# Altium project Zybo_Z7.PrjPcb (part 2 of 3)

## Sheet USB_OTG.SchDoc
size A4; SheetNumber: 7; SheetTotal: 13
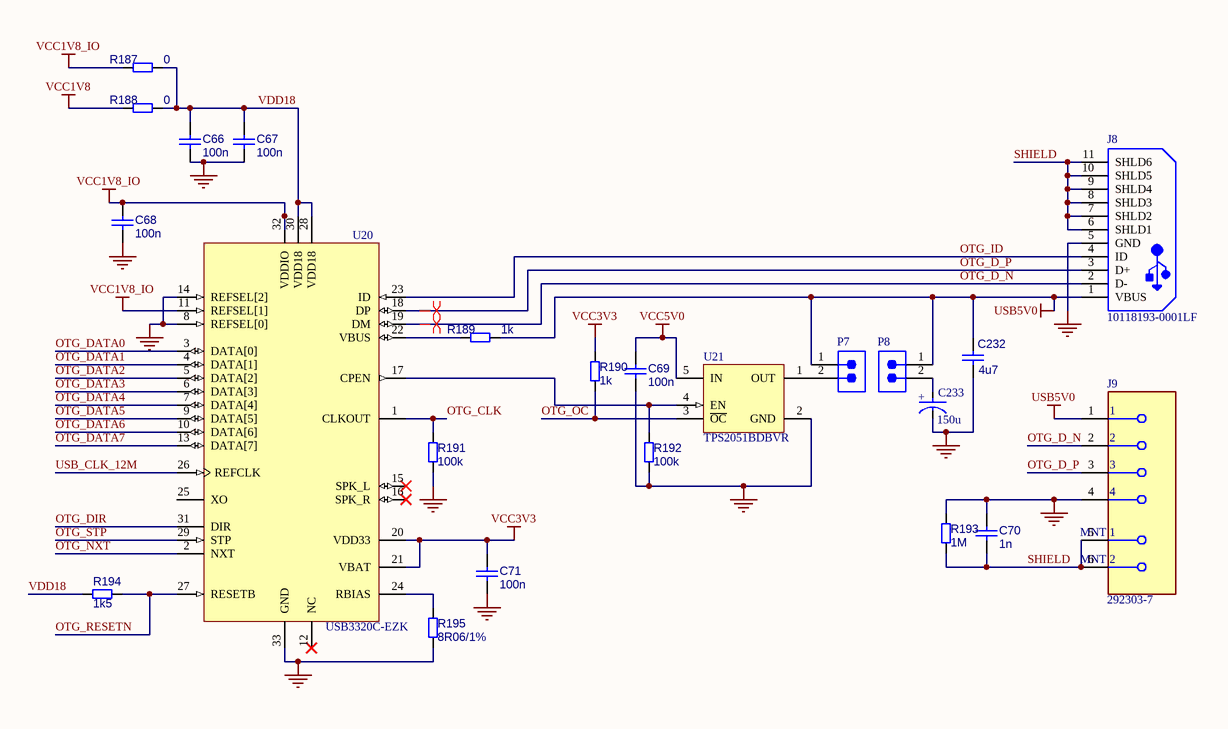
[diagram p6: USB_OTG.SchDoc]

### Parts
C66  100n  [CAPC1005X50N_0402]
C67  100n  [CAPC1005X50N_0402]
C68  100n  [CAPC1005X50N_0402]
C69  100n  [CAPC1005X50N_0402]
C70  1n  [CAPC1005X50N_0402]
C71  100n  [CAPC1005X50N_0402]
C232  4u7  [C_0805]
C233  150u  [FP-TAJD-MFG]
J8  10118193-0001LF  [FCI-10118193-0001LF-5_V]
J9  292303-7  [FP-292303-7-MFG]
P7  Male Pin Header 2x1 2.54mm  [Copy of Copy of Copy of Copy of 3M-2340-6111TG_V]  (value not drawn)
P8  Male Pin Header 2x1 2.54mm  [Copy of Copy of Copy of Copy of 3M-2340-6111TG_V]  (value not drawn)
R187  0  [R_0402]
R188  0  [R_0402]
R189  1k  [R_0402]
R190  1k  [R_0402]
R191  100k  [R_0402]
R192  100k  [R_0402]
R193  1M  [R_0402]
R194  1k5  [R_0402]
R195  8R06/1%  [R_0402]
U20  USB3320C-EZK  [MCHP-QFN-32-5x5_V2]
U21  TPS2051BDBVR  [DBV0005A_L]

### Nets
GND: C66.1 C67.1 C68.1 C69.1 C70.2 C71.1 C232.1 C233.1(C) J8.5(GND) J9.4 R191.2 R192.2 R193.1 R195.2 U20.8(REFSEL[0]) U20.14(REFSEL[2]) U20.33(GND) U21.2(GND)
USB5V0: C232.2 J8.1(VBUS) J9.1 P7.1 P8.1 R189.2
VCC1V8: R188.2
VCC1V8_IO: C68.2 R187.2 U20.11(REFSEL[1]) U20.32(VDDIO)
VCC3V3: C71.2 R190.1 U20.20(VDD33) U20.21(VBAT)
VCC5V0: C69.2 U21.5(IN)
OTG_CLK: R191.1 U20.1(CLKOUT)
OTG_D_N: J8.2(D-) J9.2 U20.19(DM)
OTG_D_P: J8.3(D+) J9.3 U20.18(DP)
OTG_DATA0: U20.3(DATA[0])
OTG_DATA1: U20.4(DATA[1])
OTG_DATA2: U20.5(DATA[2])
OTG_DATA3: U20.6(DATA[3])
OTG_DATA4: U20.7(DATA[4])
OTG_DATA5: U20.9(DATA[5])
OTG_DATA6: U20.10(DATA[6])
OTG_DATA7: U20.13(DATA[7])
OTG_DIR: U20.31(DIR)
OTG_ID: J8.4(ID) U20.23(ID)
OTG_NXT: U20.2(NXT)
OTG_OC: R190.2 U21.3(~{OC})
OTG_RESETN: R194.1 U20.27(RESETB)
OTG_STP: U20.29(STP)
SHIELD: C70.1 J8.6(SHLD1) J8.7(SHLD2) J8.8(SHLD3) J8.9(SHLD4) J8.10(SHLD5) J8.11(SHLD6) J9.5(MNT_1) J9.6(MNT_2) R193.2
USB_CLK_12M: U20.26(REFCLK)
VDD18: C66.2 C67.2 R187.1 R188.1 R194.2 U20.28(VDD18) U20.30(VDD18)
NetC233_2: C233.2(A) P8.2
NetP7_2: P7.2 U21.1(OUT)
NetR189_1: R189.1 U20.22(VBUS)
NetR192_1: R192.1 U20.17(CPEN) U21.4(EN)
NetR195_1: R195.1 U20.24(RBIAS)

Not connected (* = marked no-connect by the designer): U20 12(NC)* 15(SPK_L)* 16(SPK_R)* 25(XO)

### Layout directives
differential pair: OTG_D_N, OTG_D_P

### Notes on the sheet
- (in symbol CMP-04424-000170-1) +

### Library data of the parts
C66-C71 = CMP-001-00084-2: MLCC 0402
C232 = CMP-001-00086-2: MLCC 0805
C233 = CMP-04424-000170-1: 47uF 6.3V  ±20% 1.1Ω 2917  SMD Tantalum Capacitor; ESR (Equivalent Series Resistance): 1.1R; Dissipation Factor: 6%; Polarity: Polar; Voltage Rating: 6.3V; Width: 0.169inch; Tolerance: 20%; Series: TAJ; Case/Package: 2917; Max Operating Temperature: 125°C; Depth: 4.3mm; Voltage Rating (DC): 6.3V; Package Quantity: 500; Lead Free: Lead Free; Mount: Surface Mount; Length: 0.287inch; Min Operating Temperature: -55°C; Features: General Purpose; Packaging: Tape and Reel; Capacitance: 47uF; Height - Seated (Max): 0.122inch; RoHS Compliant: Yes
J8 = CMP-2000-05119-1: Micro USB B Type Receptacle, -55 to 85 degC, 5-Pin SMD, RoHS, Tape and Reel; Manufacturer: FCI; Insulation Resistance: 1000MOhms; Gender: Female; Current Rating: 1.8A; Number of Contacts: 5Contact; Connector Type: MicroUSBTypeBreceptacle; Mounting Angle: Right; Datasheet Version: Rev. C, 05/2015; Packaging: Reel; Product Category: USBConnectors; Standard: USB2.0; Factory Pack Quantity: 1200; Operating Temperature Range: -55Cto+85C; Termination Style: SMD/SMT; Datasheet URL: http://datasheet.octopart.com/10118193-0001LF-FCI-datasheet-55953155.pdf; Contact Material: CopperAlloy; RoHS: Details; Contact Plating: Gold; Flammability Rating: UL94V-0; Manufacturer URL: http://www.fci.com/; Brand: FCI; Product: MicroUSBTypeBConnectors; Color: Black
J9 = CMP-03360-000008-1: CONN RCPT USB2.0 TYPEA 4P SMD RA; Manufacturer: TE Connectivity; Is Female: yes; Current Rating: 1A; Number Of Contacts: 4; Voltage Rating: 30V; Conn Orientation: Right Angle; Shielding: true; Digikey Description: CONN RCPT USB2.0 TYPEA 4P SMD RA; Manufacturer Part Number: 292303-7; Automotive: No; Category: Conn; Temperature: -55°C to +85°C; ComponentLink2Description: Datasheet; Mouser Description: USB Connectors USB A R/A Recpt Assy SMT; Contact Material: Gold,Nickel; Package: 292303-7; Device Class L3: unset; Octopart: https://octopart.com/292303-7-te+connectivity-42840369; RoHS: TRUE; Device Class L2: USB Connectors; ComponentLink2URL: https://www.te.com/usa-en/product-292303-7.html?te_bu=Cor&te_type=other&te_campaign=oct_glo_cor-oct-global-oth-prtnr-fy19-oct-octo-buy-bom_sma-298_2&elqCampaignId=35216; Temperature Range Low: -55°C; Usb Standard: USB 2.0; Temperature Range High: +85°C; Lead Free: Yes; Device Class L1: Connectors
P7 P8 = CMP-002-00078-1: Male Header, Pitch 2.54 mm, 2x 1 Position, Height 8.636 mm, Tail Length 3.05 mm, -55 to 105 degC, RoHS, Bulk; Manufacturer: 3M; Max Current Rating: 3A; Rows: 1; Gender: Male; Max Operating Temperature: 105°C; Contact Finish: Gold; Datasheet URL: https://datasheet.ciiva.com/5161/ts0766-242217-5161112.pdf; Pins: 40; Package Description: Male Header, Pitch 2.54 mm, 1 x 40 Position, Height 8.636 mm, Tail Length 3.05 mm; Contact Material: Copper; Package Reference: 2340-6111TG; Package Quantity: 200; Current Rating: 3A; Datasheet Version: Aug-08; Min Operating Temperature: -55°C; Connector Type: Header; Contact Plating: Gold; Case/Package: 2340-6111TG; Packaging: Bulk; RoHS Compliant: True; Manufacturer URL: http://www.3m.com/; Lead Pitch: 0.1inch; Colour: Black; Mounting Technology: TH
R187-R195 = CMP-009-00178-3: Chip 0402 resistor
U20 = CMP-020-00028-1: Microchip USB3320C-EZK; USB Transceiver; USB 2.0 at 480Mbit/s; 32-Pin QFN; Max Supply Voltage: 2V; Frequency: 60MHz; Min Supply Voltage: 1.6V; Max Operating Temperature: 85°C; Mounting Technology: Surface Mount; Min Operating Temperature: -40°C; Pins: 32
U21 = CMP-2000-07277-1: Current-Limited, Power-Distribution Switch, 2.7 to 5.5 V, -40 to 85 degC, 5-Pin SOT-23 (DBV), Green (RoHS & no Sb/Br), Tape and Reel; Manufacturer: TexasInstruments; Number of Outputs: 1Output; Operating Supply Voltage: 2.7Vto5.5V; Supply Voltage - Min: 2.7V; Supply Voltage - Max: 5.5V; Current Limit: 1A; Development Kit: TPS2051BEVM; Output Current: 500mA; On Resistance - Max: 70mOhms; Package Version: 4073253-4/N, 12/2014; Mounting Technology: SurfaceMount; Packaging: Reel; Package / Case: SOT-23-5; Maximum Operating Temperature: +85C; Package Description: 5-Pin Small Outline Transistor, Body 2.9 x 1.6 mm, Pitch 0.95 mm; Type: HighSide; Product: USBCurrentLimitedPowerSwitches; Minimum Operating Temperature: -40C; Manufacturer URL: http://www.ti.com/; Factory Pack Quantity: 3000; Mounting Style: SMD/SMT; Brand: TexasInstruments; Package Reference: DBV5; Package URL: http://www.ti.com/lit/ml/mpds018l/mpds018l.pdf; Datasheet URL: http://www.ti.com/general/docs/lit/getliterature.tsp?genericPartNumber=TPS2051B&fileType=pdf; Product Category: PowerSwitchICs-PowerDistribution; Series: TPS2051B; Datasheet Version: Rev. L, 06/2011; RoHS: Details

## Sheet FPGA_Config_Flash.SchDoc
size A4; SheetNumber: 8; SheetTotal: 13
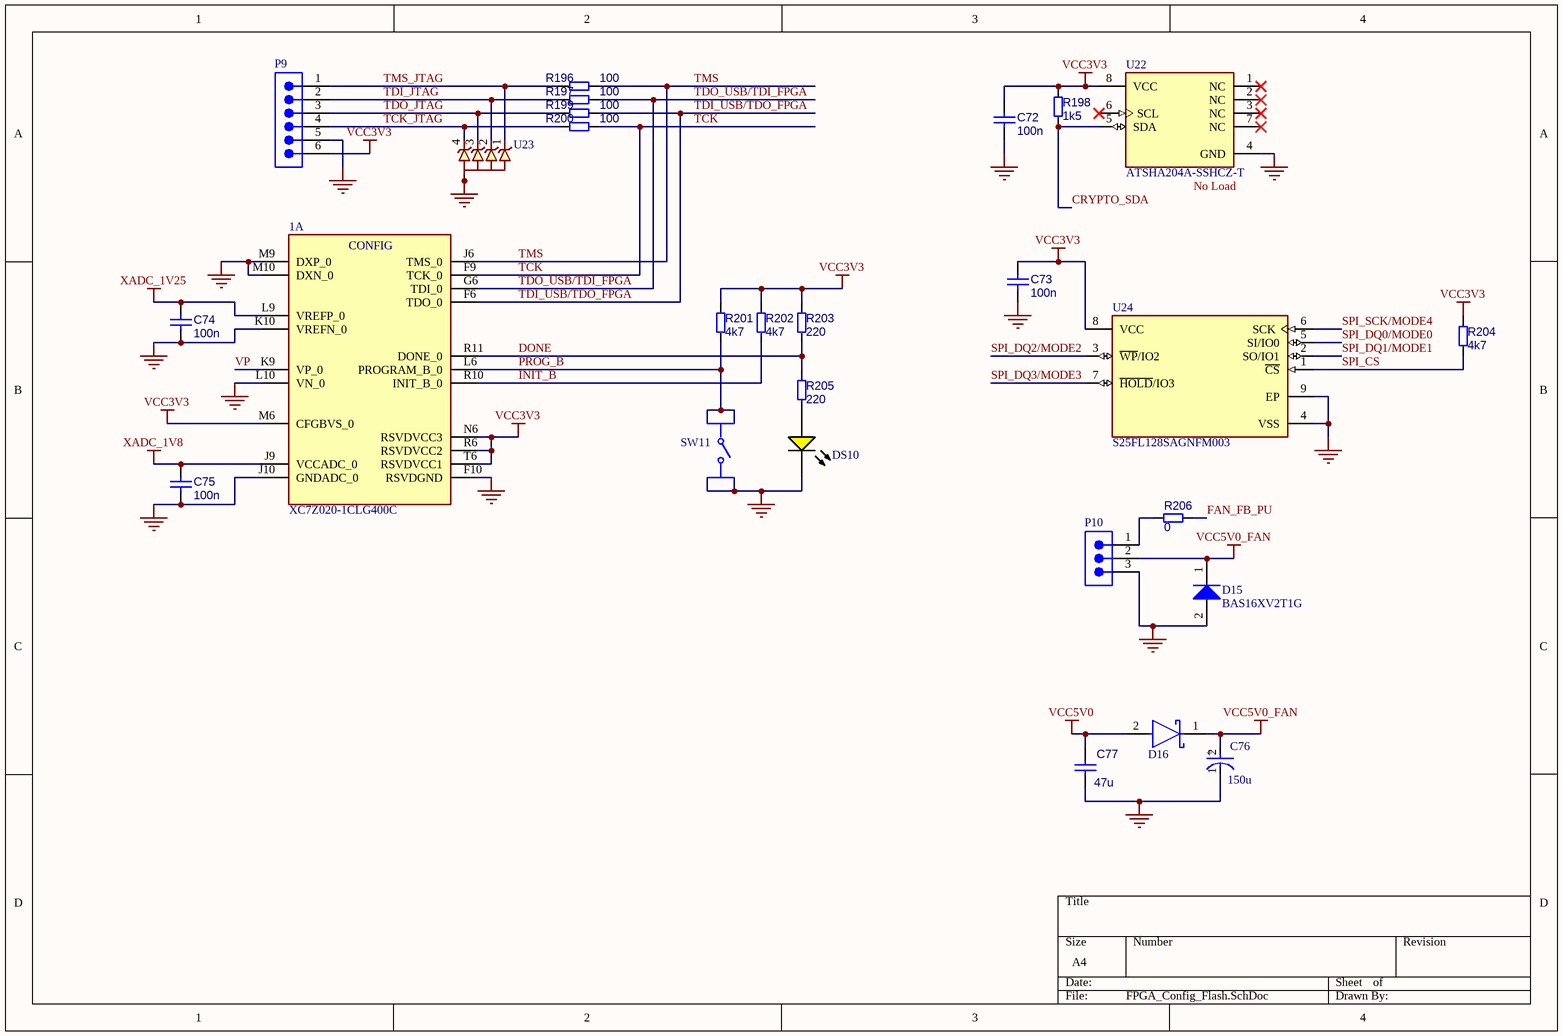
[diagram p7: FPGA_Config_Flash.SchDoc]

### Parts
1  XC7Z020-1CLG400C  [BGA400C80P20X20_1700X1700X160]  (part A of 9)
C72  100n  [CAPC1005X50N_0402]
C73  100n  [CAPC1005X50N_0402]
C74  100n  [CAPC1005X50N_0402]
C75  100n  [CAPC1005X50N_0402]
C76  150u  [FP-TAJD-MFG]
C77  47u  [C_1210]
D15  BAS16XV2T1G  [ONSC-SOD-523-2-502-01_V]
D16  CDBU0130L  [FP-502-01-MFG]  (value not drawn)
DS10  19-217/Y5C-AM1N1VY/3T  [EVRL-0603-2_V]  (value not drawn)
P9  Male Pin Header 1x6 2.54mm  [Copy of Copy of Copy of Copy of 3M-2340-6111TG_V]  (value not drawn)
P10  Male Pin Header 1x3 2.54mm  [Copy of Copy of Copy of Copy of Copy of 3M-2340-6111TG_V]  (value not drawn)
R196  100  [R_0402]
R197  100  [R_0402]
R198  1k5  [R_0402]
R199  100  [R_0402]
R200  100  [R_0402]
R201  4k7  [R_0402]
R202  4k7  [R_0402]
R203  220  [R_0402]
R204  4k7  [R_0402]
R205  220  [R_0402]
R206  0  [R_0402]
SW11  1301.9316.24  [FP-1301_9316_24-MFG]  (value not drawn)
U22  ATSHA204A-SSHCZ-T  [FP-C04-057-IPC_A]
U23  TVS0701DRBR  [FP-DRB0008A-MFG]  (value not drawn)
U24  S25FL128SAGNFM003  [FP-PG-WSON-8-IPC_A]

### Nets
GND: 1.F10(RSVDGND) 1.J10(GNDADC_0) 1.K10(VREFN_0) 1.L10(VN_0) 1.M9(DXP_0) 1.M10(DXN_0) C72.1 C73.1 C74.1 C75.1 C76.1(C) C77.1 D15.2(A) DS10.2(K) P9.5 P10.3 SW11.1 SW11.2 U22.4(GND) U23.5(GND) U23.6(GND) U23.7(GND) U23.8(GND) U23.9(Thermal_Pad) U24.4(VSS) U24.9(EP)
VCC3V3: 1.M6(CFGBVS_0) 1.N6(RSVDVCC3) 1.R6(RSVDVCC2) 1.T6(RSVDVCC1) C72.2 C73.2 P9.6 R198.2 R201.2 R202.2 R203.2 R204.2 U22.8(VCC) U24.8(VCC)
VCC5V0: C77.2 D16.2(A)
VCC5V0_FAN: C76.2(A) D15.1(K) D16.1(C) P10.2
XADC_1V8: 1.J9(VCCADC_0) C75.2
XADC_1V25: 1.L9(VREFP_0) C74.2
CRYPTO_SDA: R198.1 U22.5(SDA)
DONE: 1.R11(DONE_0) R203.1 R205.2
FAN_FB_PU: R206.1
INIT_B: 1.R10(INIT_B_0) R202.1
PROG_B: 1.L6(PROGRAM_B_0) R201.1 SW11.3 SW11.4
SPI_CS: R204.1 U24.1(~{CS})
SPI_DQ0/MODE0: U24.5(SI/IO0)
SPI_DQ1/MODE1: U24.2(SO/IO1)
SPI_DQ2/MODE2: U24.3(~{WP}/IO2)
SPI_DQ3/MODE3: U24.7(~{HOLD}/IO3)
SPI_SCK/MODE4: U24.6(SCK)
TCK: 1.F9(TCK_0) R200.1
TCK_JTAG: P9.4 R200.2 U23.4(IN)
TDI_JTAG: P9.2 R197.2 U23.2(IN)
TDI_USB/TDO_FPGA: 1.F6(TDO_0) R199.1
TDO_JTAG: P9.3 R199.2 U23.3(IN)
TDO_USB/TDI_FPGA: 1.G6(TDI_0) R197.1
TMS: 1.J6(TMS_0) R196.1
TMS_JTAG: P9.1 R196.2 U23.1(IN)
VP: 1.K9(VP_0)
NetDS10_1: DS10.1(A) R205.1
NetP10_1: P10.1 R206.2

Not connected (* = marked no-connect by the designer): U22 1(NC)* 2(NC)* 3(NC)* 6(SCL)* 7(NC)*

### Notes on the sheet
- (near U22) No Load
- (in symbol CMP-04424-000170-1) +
- (in symbol XC7Z020-1CLG400C, part A) CONFIG

### Library data of the parts
1 = XC7Z020-1CLG400C: Integrated Circuit; Manufacturer_Name: AMD; Datasheet Link: http://www.xilinx.com/support/documentation/data_sheets/ds190-Zynq-7000-Overview.pdf; Height: 1.6mm; Manufacturer_Part_Number: XC7Z020-1CLG400C; Mouser Part Number: 217-XC7Z020-1CLG400C; Mouser Price/Stock: https://www.mouser.co.uk/ProductDetail/AMD-Xilinx/XC7Z020-1CLG400C?qs=rrS6PyfT74eaxuOsP%2FGL4g%3D%3D
C72-C75 = CMP-001-00084-2: MLCC 0402
C76 = CMP-04424-000170-1: as C233 on sheet USB_OTG; Voltage Rating: 6.3V; Width: 0.169inch; Tolerance: 20%; Series: TAJ; Case/Package: 2917; Max Operating Temperature: 125°C; Depth: 4.3mm; Voltage Rating (DC): 6.3V; Package Quantity: 500; Lead Free: Lead Free; Mount: Surface Mount; Length: 0.287inch; Min Operating Temperature: -55°C; Features: General Purpose; Packaging: Tape and Reel; Capacitance: 47uF; Height - Seated (Max): 0.122inch; RoHS Compliant: Yes
C77 = CMP-001-00088-1: as C31 on sheet Audio_Codec
D15 = CMP-1054-00076-1: Switching Diode, 2-Pin SOD-523, Pb-Free, Tape and Reel; Manufacturer: On Semiconductor; trr Max (ns): 6; Configuration: Single; IF Max (A): 0.2; ComponentLink1URL: http://www.onsemi.com/; DatasheetVersion: Rev. 7; RoHS: TRUE; PackageVersion: Rev. E, 09/2010; Packing: Tape and Reel; ComponentLink2Description: Datasheet; ComponentLink2URL: http://www.onsemi.com/pub_link/Collateral/BAS16XV2T1-D.PDF; ComponentLink3Description: Package Specification; PackageReference: SOD-523-2-502-01; ComponentLink1Description: Manufacturer URL; PartNumber: BAS16XV2T1G; Mounting Technology: Surface Mount; PackageDescription: 2-Pin SOD, Body 1.2 x 0.8 mm; ComponentLink3URL: http://www.onsemi.com/pub_link/Collateral/502-01.PDF
D16 = CMP-07162-000019-1: DIODE SCHOTTKY 30V 200MA SOD523F; Manufacturer Part Number: BAT43XV2; Manufacturer: ON Semiconductor; Max Surge Forward Current: 4A; Max Junction Temp: +125°C; Value: 7pF; Peak Reverse Current: 0.5uA; ComponentLink2Description: Datasheet; Max Repetitive Reverse Voltage: 30V; Octopart: https://octopart.com/bat43xv2-on+semiconductor-84324519; Lead Free: Yes; Package: 502-01; Category: Diode; Device Class L3: Schottky Diodes; Capacitance: 7pF; Footprint Url: https://www.onsemi.com/pub/Collateral/502-01.PDF; Device Class L1: Discrete Semiconductors; Mouser Description: Schottky Diodes & Rectifiers Schottky Barrier Diode; Temperature Range High: +125°C; Device Class L2: Diodes; Temperature: to +125°C; Automotive: No; Forward Current: 200mA; RoHS: TRUE; ComponentLink2URL: https://www.onsemi.com/pub/Collateral/BAT43XV2-D.PDF; Reverse Voltage: 30V; Height: 0.7mm; Digikey Description: DIODE SCHOTTKY 30V 200MA SOD523F
DS10 = CMP-007-00005-2: Chip LED, Yellow, 5 V, 25mA, -40 to 85 degC, 2-Pin SMD (0603), RoHS, Tape and Reel; Manufacturer: Everlight Electronics; Datasheet Version: Rev. 1.0, 12/2005; Package Reference: 0603; Mounting Technology: SM; Package Description: 2-Pin Surface Mount Device, Body 1.6 x 0.8 mm; Case/Package: 0603; Datasheet URL: http://www.fairchip.com/pdf/Everlight/19-217-Y5C-AM1N1VY-3T.pdf; Manufacturer URL: http://www.everlight.com/; RoHS Compliant: False
P9 = CMP-002-00079-1: Male Header, Pitch 2.54 mm, 1x6 Position, Height 8.636 mm, Tail Length 3.05 mm, -55 to 105 degC, RoHS, Bulk; Manufacturer: 3M; Max Current Rating: 3A; Rows: 1; Manufacturer URL: http://www.3m.com/; RoHS Compliant: True; Max Operating Temperature: 105°C; Connector Type: Header; Packaging: Bulk; Pins: 40; Current Rating: 3A; Package Reference: 2340-6111TG; Min Operating Temperature: -55°C; Datasheet Version: Aug-08; Colour: Black; Package Description: Male Header, Pitch 2.54 mm, 1 x 40 Position, Height 8.636 mm, Tail Length 3.05 mm; Contact Finish: Gold; Contact Material: Copper; Case/Package: 2340-6111TG; Contact Plating: Gold; Datasheet URL: https://datasheet.ciiva.com/5161/ts0766-242217-5161112.pdf; Gender: Male; Mounting Technology: TH; Package Quantity: 200; Lead Pitch: 0.1inch
P10 = CMP-002-00080-1: Male Header, Pitch 2.54 mm, 1x3 Position, Height 8.636 mm, Tail Length 3.05 mm, -55 to 105 degC, RoHS, Bulk; Manufacturer: 3M; Rows: 1; Current Rating: 3A; Mounting Technology: TH; Contact Plating: Gold; Packaging: Bulk; Lead Pitch: 0.1inch; Case/Package: 2340-6111TG; Contact Material: Copper; Pins: 40; Package Description: Male Header, Pitch 2.54 mm, 1 x 40 Position, Height 8.636 mm, Tail Length 3.05 mm; RoHS Compliant: True; Connector Type: Header; Manufacturer URL: http://www.3m.com/; Contact Finish: Gold; Max Operating Temperature: 105°C; Min Operating Temperature: -55°C; Max Current Rating: 3A; Gender: Male; Package Quantity: 200; Colour: Black; Package Reference: 2340-6111TG; Datasheet URL: https://datasheet.ciiva.com/5161/ts0766-242217-5161112.pdf; Datasheet Version: Aug-08
R196-R206 = CMP-009-00178-3: Chip 0402 resistor
SW11 = CMP-00030-00001-1: Switch Tactile N.O. SPST Round Button Gull Wing 0.05A 12VDC >100000Cycles 1.6N SMD T/R; Max Operating Temperature: 70°C; Case/Package: SMD/SMT; Mounting Technology: Surface Mount; Min Operating Temperature: -20°C
U22 = CMP-06313-000167-1: IC AUTHENTICATION CHIP 8SOIC; Output Voltage: 400mV; Min Supply Voltage: 2V; Interface: Serial; Density: 4.5Kb; Output Current: 4mA; Access Time: 550ns; Max Frequency: 1MHz; Number of Input Lines: 1; Max Supply Voltage: 5.5V; RoHS Compliant: Yes; Case/Package: SOIC; Lead Free: Lead Free; Weight: 0.019048oz; Min Operating Temperature: -40°C; Series: CryptoAuthentication™; Number of Pins: 8; Packaging: Cut Tape; Package Quantity: 1; Number of Output Lines: 1; Contact Plating: Gold; Mount: Surface Mount; Max Operating Temperature: 85°C
U23 = CMP-031-00006-4: 7-V bidirectional flat-clamp surge protection device 8-SON -40 to 125; Min Operating Temperature: -40°C; Pins: 8; Max Operating Temperature: 125°C
U24 = CMP-00196-112300131-1: S25FL128SAGNFM003 NOR Flash 128Mbit 32M X 4Bit/64M X 2Bit/128M X 1Bit Serial-SPI 8-Pin WSON T/R; Access Time: 8ns; Max Supply Voltage: 3.6V; Memory Size: 16MB; Memory Type: FLASH, NOR; Frequency: 133MHz; Min Supply Voltage: 1.65V; Interface: SPI; Height: 800µm; Min Operating Temperature: -40°C; NexarPartId: 112300131; Max Operating Temperature: 125°C; Ambient Temperature Range High: 125°C

## Sheet DDR_and_MIO_Banks.SchDoc
size A4; SheetNumber: 9; SheetTotal: 13
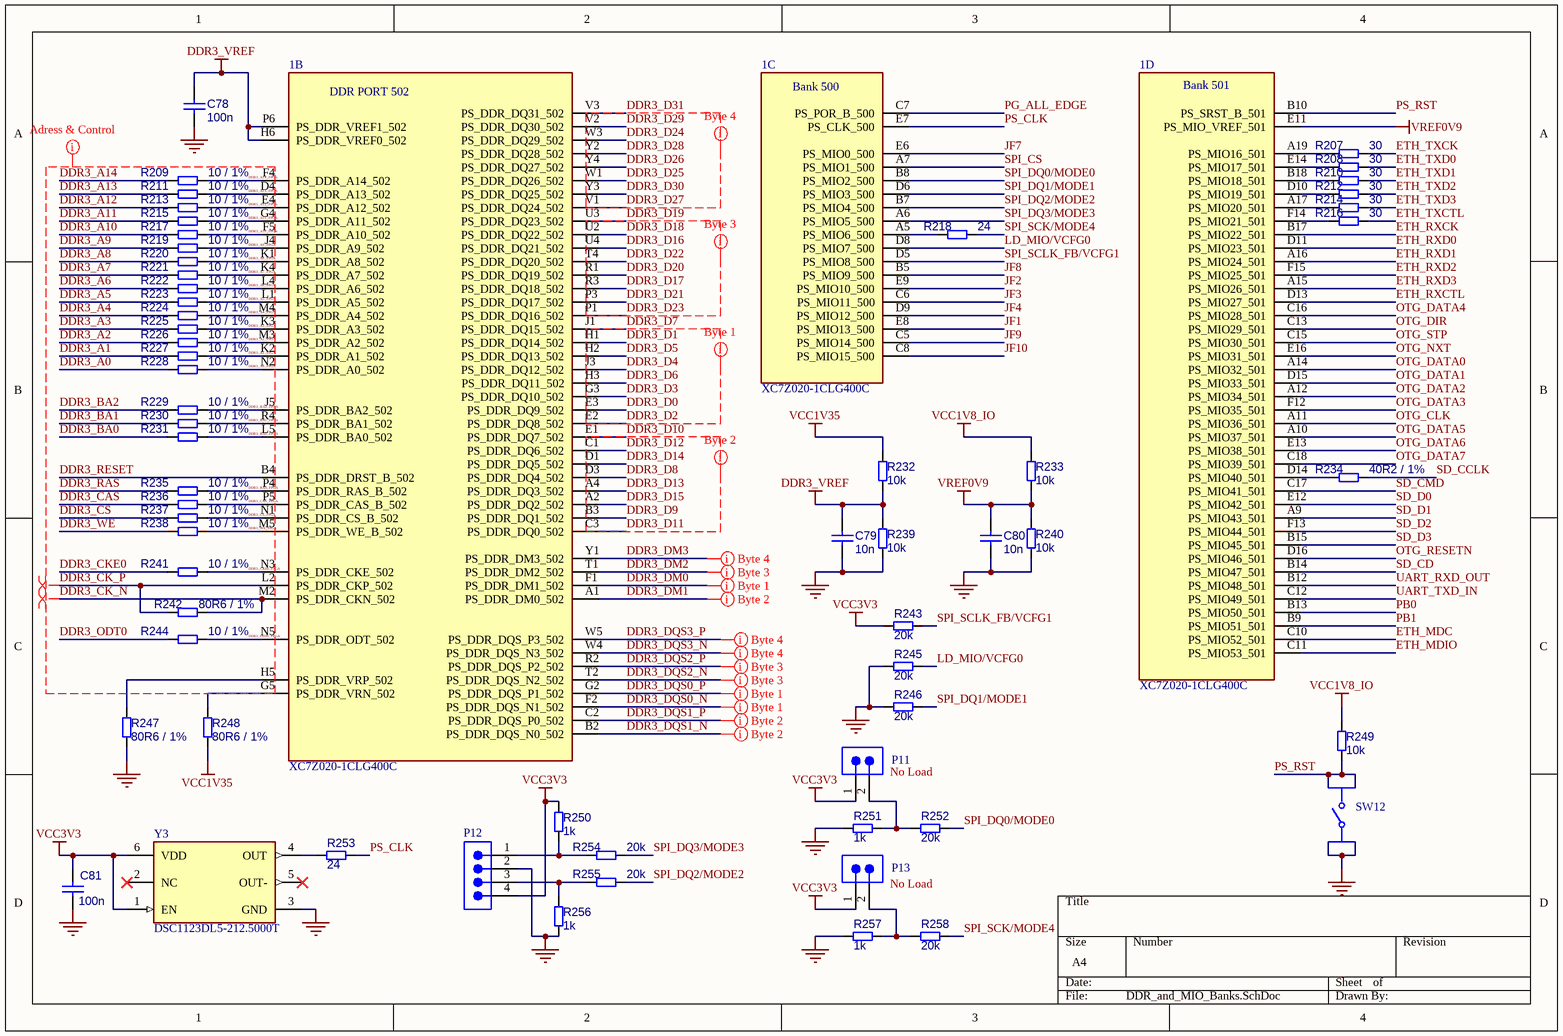
[diagram p8: DDR_and_MIO_Banks.SchDoc]

### Parts
1  XC7Z020-1CLG400C  [BGA400C80P20X20_1700X1700X160]  (parts B,C,D of 9)
C78  100n  [CAPC1005X50N_0402]
C79  10n  [CAPC1005X50N_0402]
C80  10n  [CAPC1005X50N_0402]
C81  100n  [CAPC1005X50N_0402]
P11  Male Pin Header 2x1 2.54mm  [Copy of Copy of Copy of Copy of 3M-2340-6111TG_V]  (value not drawn)
P12  Male Pin Header 1x4 2.54mm  [Copy of Copy of Copy of Copy of Copy of 3M-2340-6111TG_V]  (value not drawn)
P13  Male Pin Header 2x1 2.54mm  [Copy of Copy of Copy of Copy of 3M-2340-6111TG_V]  (value not drawn)
R207  30  [R_0402]
R208  30  [R_0402]
R209  10 / 1%  [R_0402]
R210  30  [R_0402]
R211  10 / 1%  [R_0402]
R212  30  [R_0402]
R213  10 / 1%  [R_0402]
R214  30  [R_0402]
R215  10 / 1%  [R_0402]
R216  30  [R_0402]
R217  10 / 1%  [R_0402]
R218  24  [R_0402]
R219  10 / 1%  [R_0402]
R220  10 / 1%  [R_0402]
R221  10 / 1%  [R_0402]
R222  10 / 1%  [R_0402]
R223  10 / 1%  [R_0402]
R224  10 / 1%  [R_0402]
R225  10 / 1%  [R_0402]
R226  10 / 1%  [R_0402]
R227  10 / 1%  [R_0402]
R228  10 / 1%  [R_0402]
R229  10 / 1%  [R_0402]
R230  10 / 1%  [R_0402]
R231  10 / 1%  [R_0402]
R232  10k  [R_0402]
R233  10k  [R_0402]
R234  40R2 / 1%  [R_0402]
R235  10 / 1%  [R_0402]
R236  10 / 1%  [R_0402]
R237  10 / 1%  [R_0402]
R238  10 / 1%  [R_0402]
R239  10k  [R_0402]
R240  10k  [R_0402]
R241  10 / 1%  [R_0402]
R242  80R6 / 1%  [R_0402]
R243  20k  [R_0402]
R244  10 / 1%  [R_0402]
R245  20k  [R_0402]
R246  20k  [R_0402]
R247  80R6 / 1%  [R_0402]
R248  80R6 / 1%  [R_0402]
R249  10k  [R_0402]
R250  1k  [R_0402]
R251  1k  [R_0402]
R252  20k  [R_0402]
R253  24  [R_0402]
R254  20k  [R_0402]
R255  20k  [R_0402]
R256  1k  [R_0402]
R257  1k  [R_0402]
R258  20k  [R_0402]
SW12  1301.9316.24  [FP-1301_9316_24-MFG]  (value not drawn)
Y3  DSC1123DL5-212.5000T  [FP-C04-1005-MFG]

### Nets
DDR3_VREF: 1.H6(PS_DDR_VREF0_502) 1.P6(PS_DDR_VREF1_502) C78.2 C79.2 R232.2 R239.1
GND: C78.1 C79.1 C80.1 C81.1 P12.2 R239.2 R240.2 R245.1 R246.1 R247.2 R251.1 R256.2 R257.1 SW12.3 SW12.4 Y3.3(GND)
VCC1V8_IO: R233.1 R249.2
VCC1V35: R232.1 R248.2
VCC3V3: C81.2 P11.1 P12.4 P13.1 R243.1 R250.1 Y3.1(EN) Y3.6(VDD)
VREF0V9: 1.E11(PS_MIO_VREF_501) C80.2 R233.2 R240.1
DDR3_A0: R228.2
DDR3_A0_FPGA: 1.N2(PS_DDR_A0_502) R228.1
DDR3_A1: R227.2
DDR3_A1_FPGA: 1.K2(PS_DDR_A1_502) R227.1
DDR3_A2: R226.2
DDR3_A2_FPGA: 1.M3(PS_DDR_A2_502) R226.1
DDR3_A3: R225.2
DDR3_A3_FPGA: 1.K3(PS_DDR_A3_502) R225.1
DDR3_A4: R224.2
DDR3_A4_FPGA: 1.M4(PS_DDR_A4_502) R224.1
DDR3_A5: R223.2
DDR3_A5_FPGA: 1.L1(PS_DDR_A5_502) R223.1
DDR3_A6: R222.2
DDR3_A6_FPGA: 1.L4(PS_DDR_A6_502) R222.1
DDR3_A7: R221.2
DDR3_A7_FPGA: 1.K4(PS_DDR_A7_502) R221.1
DDR3_A8: R220.2
DDR3_A8_FPGA: 1.K1(PS_DDR_A8_502) R220.1
DDR3_A9: R219.2
DDR3_A9_FPGA: 1.J4(PS_DDR_A9_502) R219.1
DDR3_A10: R217.2
DDR3_A10_FPGA: 1.F5(PS_DDR_A10_502) R217.1
DDR3_A11: R215.2
DDR3_A11_FPGA: 1.G4(PS_DDR_A11_502) R215.1
DDR3_A12: R213.2
DDR3_A12_FPGA: 1.E4(PS_DDR_A12_502) R213.1
DDR3_A13: R211.2
DDR3_A13_FPGA: 1.D4(PS_DDR_A13_502) R211.1
DDR3_A14: R209.2
DDR3_A14_FPGA: 1.F4(PS_DDR_A14_502) R209.1
DDR3_BA0: R231.2
DDR3_BA0_FPGA: 1.L5(PS_DDR_BA0_502) R231.1
DDR3_BA1: R230.2
DDR3_BA1_FPGA: 1.R4(PS_DDR_BA1_502) R230.1
DDR3_BA2: R229.2
DDR3_BA2_FPGA: 1.J5(PS_DDR_BA2_502) R229.1
DDR3_CAS: R236.2
DDR3_CAS_FPGA: 1.P5(PS_DDR_CAS_B_502) R236.1
DDR3_CK_N: 1.M2(PS_DDR_CKN_502) R242.1
DDR3_CK_P: 1.L2(PS_DDR_CKP_502) R242.2
DDR3_CKE0: R241.2
DDR3_CKE0_FPGA: 1.N3(PS_DDR_CKE_502) R241.1
DDR3_CS: R237.2
DDR3_CS_FPGA: 1.N1(PS_DDR_CS_B_502) R237.1
DDR3_D0: 1.E3(PS_DDR_DQ9_502)
DDR3_D1: 1.H1(PS_DDR_DQ14_502)
DDR3_D2: 1.E2(PS_DDR_DQ8_502)
DDR3_D3: 1.G3(PS_DDR_DQ10_502)
DDR3_D4: 1.J3(PS_DDR_DQ12_502)
DDR3_D5: 1.H2(PS_DDR_DQ13_502)
DDR3_D6: 1.H3(PS_DDR_DQ11_502)
DDR3_D7: 1.J1(PS_DDR_DQ15_502)
DDR3_D8: 1.D3(PS_DDR_DQ4_502)
DDR3_D9: 1.B3(PS_DDR_DQ1_502)
DDR3_D10: 1.E1(PS_DDR_DQ7_502)
DDR3_D11: 1.C3(PS_DDR_DQ0_502)
DDR3_D12: 1.C1(PS_DDR_DQ6_502)
DDR3_D13: 1.A4(PS_DDR_DQ3_502)
DDR3_D14: 1.D1(PS_DDR_DQ5_502)
DDR3_D15: 1.A2(PS_DDR_DQ2_502)
DDR3_D16: 1.U4(PS_DDR_DQ21_502)
DDR3_D17: 1.R3(PS_DDR_DQ18_502)
DDR3_D18: 1.U2(PS_DDR_DQ22_502)
DDR3_D19: 1.U3(PS_DDR_DQ23_502)
DDR3_D20: 1.R1(PS_DDR_DQ19_502)
DDR3_D21: 1.P3(PS_DDR_DQ17_502)
DDR3_D22: 1.T4(PS_DDR_DQ20_502)
DDR3_D23: 1.P1(PS_DDR_DQ16_502)
DDR3_D24: 1.W3(PS_DDR_DQ29_502)
DDR3_D25: 1.W1(PS_DDR_DQ26_502)
DDR3_D26: 1.Y4(PS_DDR_DQ27_502)
DDR3_D27: 1.V1(PS_DDR_DQ24_502)
DDR3_D28: 1.Y2(PS_DDR_DQ28_502)
DDR3_D29: 1.V2(PS_DDR_DQ30_502)
DDR3_D30: 1.Y3(PS_DDR_DQ25_502)
DDR3_D31: 1.V3(PS_DDR_DQ31_502)
DDR3_DM0: 1.F1(PS_DDR_DM1_502)
DDR3_DM1: 1.A1(PS_DDR_DM0_502)
DDR3_DM2: 1.T1(PS_DDR_DM2_502)
DDR3_DM3: 1.Y1(PS_DDR_DM3_502)
DDR3_DQS0_N: 1.F2(PS_DDR_DQS_N1_502)
DDR3_DQS0_P: 1.G2(PS_DDR_DQS_P1_502)
DDR3_DQS1_N: 1.B2(PS_DDR_DQS_N0_502)
DDR3_DQS1_P: 1.C2(PS_DDR_DQS_P0_502)
DDR3_DQS2_N: 1.T2(PS_DDR_DQS_N2_502)
DDR3_DQS2_P: 1.R2(PS_DDR_DQS_P2_502)
DDR3_DQS3_N: 1.W4(PS_DDR_DQS_N3_502)
DDR3_DQS3_P: 1.W5(PS_DDR_DQS_P3_502)
DDR3_ODT0: R244.2
DDR3_ODT0_FPGA: 1.N5(PS_DDR_ODT_502) R244.1
DDR3_RAS: R235.2
DDR3_RAS_FPGA: 1.P4(PS_DDR_RAS_B_502) R235.1
DDR3_RESET: 1.B4(PS_DDR_DRST_B_502)
DDR3_WE: R238.2
DDR3_WE_FPGA: 1.M5(PS_DDR_WE_B_502) R238.1
ETH_MDC: 1.C10(PS_MIO52_501)
ETH_MDIO: 1.C11(PS_MIO53_501)
ETH_RXCK: 1.B17(PS_MIO22_501)
ETH_RXCTL: 1.D13(PS_MIO27_501)
ETH_RXD0: 1.D11(PS_MIO23_501)
ETH_RXD1: 1.A16(PS_MIO24_501)
ETH_RXD2: 1.F15(PS_MIO25_501)
ETH_RXD3: 1.A15(PS_MIO26_501)
ETH_TXCK: R207.1
ETH_TXCTL: R216.1
ETH_TXD0: R208.1
ETH_TXD1: R210.1
ETH_TXD2: R212.1
ETH_TXD3: R214.1
JF1: 1.E8(PS_MIO13_500)
JF2: 1.E9(PS_MIO10_500)
JF3: 1.C6(PS_MIO11_500)
JF4: 1.D9(PS_MIO12_500)
JF7: 1.E6(PS_MIO0_500)
JF8: 1.B5(PS_MIO9_500)
JF9: 1.C5(PS_MIO14_500)
JF10: 1.C8(PS_MIO15_500)
LD_MIO/VCFG0: 1.D8(PS_MIO7_500) R245.2
OTG_CLK: 1.A11(PS_MIO36_501)
OTG_DATA0: 1.A14(PS_MIO32_501)
OTG_DATA1: 1.D15(PS_MIO33_501)
OTG_DATA2: 1.A12(PS_MIO34_501)
OTG_DATA3: 1.F12(PS_MIO35_501)
OTG_DATA4: 1.C16(PS_MIO28_501)
OTG_DATA5: 1.A10(PS_MIO37_501)
OTG_DATA6: 1.E13(PS_MIO38_501)
OTG_DATA7: 1.C18(PS_MIO39_501)
OTG_DIR: 1.C13(PS_MIO29_501)
OTG_NXT: 1.E16(PS_MIO31_501)
OTG_RESETN: 1.D16(PS_MIO46_501)
OTG_STP: 1.C15(PS_MIO30_501)
PB0: 1.B13(PS_MIO50_501)
PB1: 1.B9(PS_MIO51_501)
PG_ALL_EDGE: 1.C7(PS_POR_B_500)
PS_CLK: 1.E7(PS_CLK_500) R253.1
PS_RST: 1.B10(PS_SRST_B_501) R249.1 SW12.1 SW12.2
SD_CCLK: R234.1
SD_CD: 1.B14(PS_MIO47_501)
SD_CMD: 1.C17(PS_MIO41_501)
SD_D0: 1.E12(PS_MIO42_501)
SD_D1: 1.A9(PS_MIO43_501)
SD_D2: 1.F13(PS_MIO44_501)
SD_D3: 1.B15(PS_MIO45_501)
SPI_CS: 1.A7(PS_MIO1_500)
SPI_DQ0/MODE0: 1.B8(PS_MIO2_500) R252.2
SPI_DQ1/MODE1: 1.D6(PS_MIO3_500) R246.2
SPI_DQ2/MODE2: 1.B7(PS_MIO4_500) R255.2
SPI_DQ3/MODE3: 1.A6(PS_MIO5_500) R254.2
SPI_SCK/MODE4: R218.1 R258.2
SPI_SCLK_FB/VCFG1: 1.D5(PS_MIO8_500) R243.2
UART_RXD_OUT: 1.B12(PS_MIO48_501)
UART_TXD_IN: 1.C12(PS_MIO49_501)
Net1_A5: 1.A5(PS_MIO6_500) R218.2
Net1_A17: 1.A17(PS_MIO20_501) R214.2
Net1_A19: 1.A19(PS_MIO16_501) R207.2
Net1_B18: 1.B18(PS_MIO18_501) R210.2
Net1_D10: 1.D10(PS_MIO19_501) R212.2
Net1_D14: 1.D14(PS_MIO40_501) R234.2
Net1_E14: 1.E14(PS_MIO17_501) R208.2
Net1_F14: 1.F14(PS_MIO21_501) R216.2
Net1_G5: 1.G5(PS_DDR_VRN_502) R248.1
Net1_H5: 1.H5(PS_DDR_VRP_502) R247.1
NetP11_2: P11.2 R251.2 R252.1
NetP12_1: P12.1 R250.2 R254.1
NetP12_3: P12.3 R255.1 R256.1
NetP13_2: P13.2 R257.2 R258.1
NetR253_2: R253.2 Y3.4(OUT)

Not connected (* = marked no-connect by the designer): Y3 2(NC)* 5(OUT-)*

### Layout directives
differential pair: DDR3_CK_N, DDR3_CK_P
net class DDR_B4_D: DDR3_D24, DDR3_D25, DDR3_D26, DDR3_D27, DDR3_D28, DDR3_D29, DDR3_D30, DDR3_D31, DDR3_DM3, DDR3_DQS3_N, DDR3_DQS3_P
net class DDR_B3_D: DDR3_D16, DDR3_D17, DDR3_D18, DDR3_D19, DDR3_D20, DDR3_D21, DDR3_D22, DDR3_D23, DDR3_DM2, DDR3_DQS2_N, DDR3_DQS2_P
net class DDR_B1_D: DDR3_D0, DDR3_D1, DDR3_D2, DDR3_D3, DDR3_D4, DDR3_D5, DDR3_D6, DDR3_D7, DDR3_DM0, DDR3_DQS0_N, DDR3_DQS0_P
net class DDR_B2_D: DDR3_D8, DDR3_D9, DDR3_D10, DDR3_D11, DDR3_D12, DDR3_D13, DDR3_D14, DDR3_D15, DDR3_DM1, DDR3_DQS1_N, DDR3_DQS1_P
net class DDR_ADR_CTRL: DDR3_A0, DDR3_A0_FPGA, DDR3_A1, DDR3_A1_FPGA, DDR3_A2, DDR3_A2_FPGA, DDR3_A3, DDR3_A3_FPGA, DDR3_A4, DDR3_A4_FPGA, DDR3_A5, DDR3_A5_FPGA, DDR3_A6, DDR3_A6_FPGA, DDR3_A7, DDR3_A7_FPGA, DDR3_A8, DDR3_A8_FPGA, DDR3_A9, DDR3_A9_FPGA, DDR3_A10, DDR3_A10_FPGA, DDR3_A11, DDR3_A11_FPGA, DDR3_A12, DDR3_A12_FPGA, DDR3_A13, DDR3_A13_FPGA, DDR3_A14, DDR3_A14_FPGA, DDR3_BA0, DDR3_BA0_FPGA, DDR3_BA1, DDR3_BA1_FPGA, DDR3_BA2, DDR3_BA2_FPGA, DDR3_CAS, DDR3_CAS_FPGA, DDR3_CK_N, DDR3_CK_P, DDR3_CKE0, DDR3_CKE0_FPGA, DDR3_CS, DDR3_CS_FPGA, DDR3_ODT0, DDR3_ODT0_FPGA, DDR3_RAS, DDR3_RAS_FPGA, DDR3_RESET, DDR3_WE, DDR3_WE_FPGA

### Notes on the sheet
- (near P11) No Load
- (near P13) No Load
- (in symbol XC7Z020-1CLG400C, part B) DDR PORT 502
- (in symbol XC7Z020-1CLG400C, part C) Bank 500
- (in symbol XC7Z020-1CLG400C, part D) Bank 501

### Library data of the parts
1 = XC7Z020-1CLG400C: as 1 on sheet FPGA_Config_Flash; Datasheet Link: http://www.xilinx.com/support/documentation/data_sheets/ds190-Zynq-7000-Overview.pdf; Height: 1.6mm; Manufacturer_Part_Number: XC7Z020-1CLG400C; Mouser Part Number: 217-XC7Z020-1CLG400C; Mouser Price/Stock: https://www.mouser.co.uk/ProductDetail/AMD-Xilinx/XC7Z020-1CLG400C?qs=rrS6PyfT74eaxuOsP%2FGL4g%3D%3D
C78-C81 = CMP-001-00084-2: MLCC 0402
P11 P13 = CMP-002-00078-1: as P7 on sheet USB_OTG; Gender: Male; Max Operating Temperature: 105°C; Contact Finish: Gold; Datasheet URL: https://datasheet.ciiva.com/5161/ts0766-242217-5161112.pdf; Pins: 40; Package Description: Male Header, Pitch 2.54 mm, 1 x 40 Position, Height 8.636 mm, Tail Length 3.05 mm; Contact Material: Copper; Package Reference: 2340-6111TG; Package Quantity: 200; Current Rating: 3A; Datasheet Version: Aug-08; Min Operating Temperature: -55°C; Connector Type: Header; Contact Plating: Gold; Case/Package: 2340-6111TG; Packaging: Bulk; RoHS Compliant: True; Manufacturer URL: http://www.3m.com/; Lead Pitch: 0.1inch; Colour: Black; Mounting Technology: TH
P12 = CMP-002-00081-1: Male Header, Pitch 2.54 mm, 1x4 Position, Height 8.636 mm, Tail Length 3.05 mm, -55 to 105 degC, RoHS, Bulk; Manufacturer: 3M; Current Rating: 3A; Rows: 1; Max Operating Temperature: 105°C; Connector Type: Header; Datasheet Version: Aug-08; Min Operating Temperature: -55°C; Manufacturer URL: http://www.3m.com/; Package Description: Male Header, Pitch 2.54 mm, 1 x 40 Position, Height 8.636 mm, Tail Length 3.05 mm; Datasheet URL: https://datasheet.ciiva.com/5161/ts0766-242217-5161112.pdf; Case/Package: 2340-6111TG; Contact Plating: Gold; Contact Material: Copper; Packaging: Bulk; RoHS Compliant: True; Gender: Male; Lead Pitch: 0.1inch; Pins: 40; Package Reference: 2340-6111TG; Package Quantity: 200; Max Current Rating: 3A; Mounting Technology: TH; Contact Finish: Gold; Colour: Black
R207-R258 = CMP-009-00178-3: Chip 0402 resistor
SW12 = CMP-00030-00001-1: as SW11 on sheet FPGA_Config_Flash; Max Operating Temperature: 70°C; Case/Package: SMD/SMT; Mounting Technology: Surface Mount; Min Operating Temperature: -20°C
Y3 = CMP-06255-000108-1: MEMS OSC XO 212.5000MHZ LVDS SMD; Frequency: 212.5MHz; Max Supply Current: 32mA; Frequency Stability: 10ppm; Series: DSC1123; Ratings: AEC-Q100; Min Operating Temperature: -40°C; Length: 0.098inch; Case/Package: SMD/SMT; Height: 0.035inch; Max Operating Temperature: 105°C; Width: 0.079inch; Packaging: Tape and Reel; Mount: Surface Mount

## Sheet FPGA_Banks_and_Filters.SchDoc
size A4; SheetNumber: 10; SheetTotal: 13
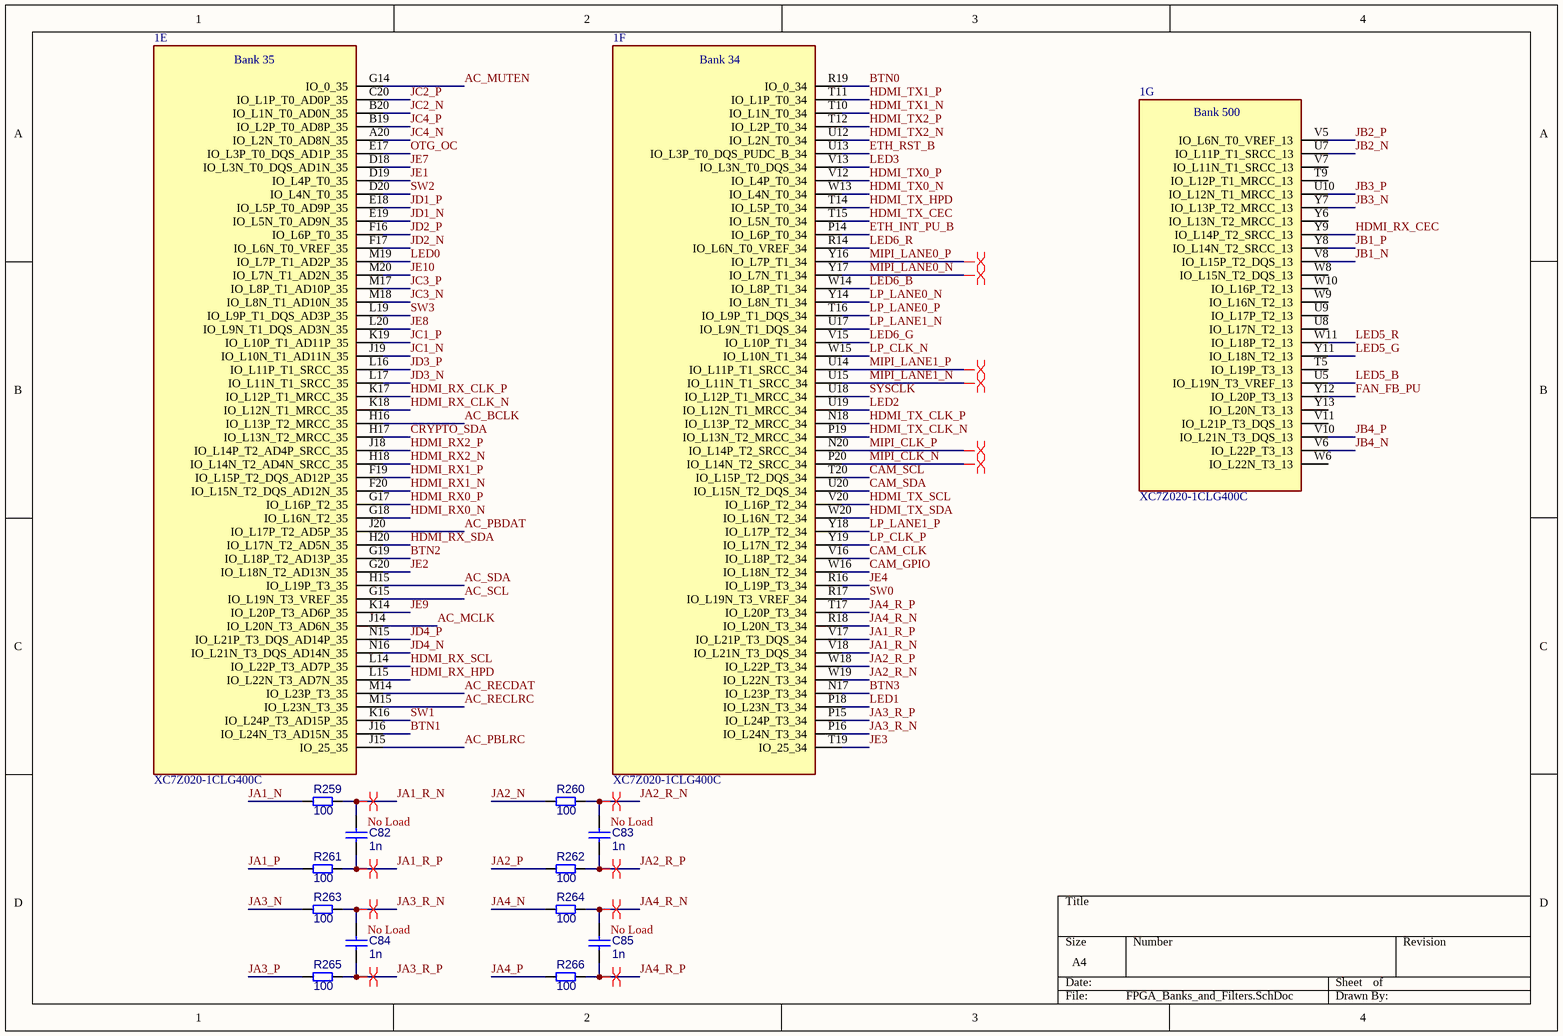
[diagram p9: FPGA_Banks_and_Filters.SchDoc]

### Parts
1  XC7Z020-1CLG400C  [BGA400C80P20X20_1700X1700X160]  (parts E,F,G of 9)
C82  1n  [CAPC1005X50N_0402]
C83  1n  [CAPC1005X50N_0402]
C84  1n  [CAPC1005X50N_0402]
C85  1n  [CAPC1005X50N_0402]
R259  100  [R_0402]
R260  100  [R_0402]
R261  100  [R_0402]
R262  100  [R_0402]
R263  100  [R_0402]
R264  100  [R_0402]
R265  100  [R_0402]
R266  100  [R_0402]

### Nets
AC_BCLK: 1.H16(IO_L13P_T2_MRCC_35)
AC_MCLK: 1.J14(IO_L20N_T3_AD6N_35)
AC_MUTEN: 1.G14(IO_0_35)
AC_PBDAT: 1.J20(IO_L17P_T2_AD5P_35)
AC_PBLRC: 1.J15(IO_25_35)
AC_RECDAT: 1.M14(IO_L23P_T3_35)
AC_RECLRC: 1.M15(IO_L23N_T3_35)
AC_SCL: 1.G15(IO_L19N_T3_VREF_35)
AC_SDA: 1.H15(IO_L19P_T3_35)
BTN0: 1.R19(IO_0_34)
BTN1: 1.J16(IO_L24N_T3_AD15N_35)
BTN2: 1.G19(IO_L18P_T2_AD13P_35)
BTN3: 1.N17(IO_L23P_T3_34)
CAM_CLK: 1.V16(IO_L18P_T2_34)
CAM_GPIO: 1.W16(IO_L18N_T2_34)
CAM_SCL: 1.T20(IO_L15P_T2_DQS_34)
CAM_SDA: 1.U20(IO_L15N_T2_DQS_34)
CRYPTO_SDA: 1.H17(IO_L13N_T2_MRCC_35)
ETH_INT_PU_B: 1.P14(IO_L6P_T0_34)
ETH_RST_B: 1.U13(IO_L3P_T0_DQS_PUDC_B_34)
FAN_FB_PU: 1.Y12(IO_L20P_T3_13)
HDMI_RX0_N: 1.G18(IO_L16N_T2_35)
HDMI_RX0_P: 1.G17(IO_L16P_T2_35)
HDMI_RX1_N: 1.F20(IO_L15N_T2_DQS_AD12N_35)
HDMI_RX1_P: 1.F19(IO_L15P_T2_DQS_AD12P_35)
HDMI_RX2_N: 1.H18(IO_L14N_T2_AD4N_SRCC_35)
HDMI_RX2_P: 1.J18(IO_L14P_T2_AD4P_SRCC_35)
HDMI_RX_CEC: 1.Y9(IO_L14P_T2_SRCC_13)
HDMI_RX_CLK_N: 1.K18(IO_L12N_T1_MRCC_35)
HDMI_RX_CLK_P: 1.K17(IO_L12P_T1_MRCC_35)
HDMI_RX_HPD: 1.L15(IO_L22N_T3_AD7N_35)
HDMI_RX_SCL: 1.L14(IO_L22P_T3_AD7P_35)
HDMI_RX_SDA: 1.H20(IO_L17N_T2_AD5N_35)
HDMI_TX0_N: 1.W13(IO_L4N_T0_34)
HDMI_TX0_P: 1.V12(IO_L4P_T0_34)
HDMI_TX1_N: 1.T10(IO_L1N_T0_34)
HDMI_TX1_P: 1.T11(IO_L1P_T0_34)
HDMI_TX2_N: 1.U12(IO_L2N_T0_34)
HDMI_TX2_P: 1.T12(IO_L2P_T0_34)
HDMI_TX_CEC: 1.T15(IO_L5N_T0_34)
HDMI_TX_CLK_N: 1.P19(IO_L13N_T2_MRCC_34)
HDMI_TX_CLK_P: 1.N18(IO_L13P_T2_MRCC_34)
HDMI_TX_HPD: 1.T14(IO_L5P_T0_34)
HDMI_TX_SCL: 1.V20(IO_L16P_T2_34)
HDMI_TX_SDA: 1.W20(IO_L16N_T2_34)
JA1_N: R259.1
JA1_P: R261.1
JA1_R_N: 1.V18(IO_L21N_T3_DQS_34) C82.2 R259.2
JA1_R_P: 1.V17(IO_L21P_T3_DQS_34) C82.1 R261.2
JA2_N: R260.1
JA2_P: R262.1
JA2_R_N: 1.W19(IO_L22N_T3_34) C83.2 R260.2
JA2_R_P: 1.W18(IO_L22P_T3_34) C83.1 R262.2
JA3_N: R263.1
JA3_P: R265.1
JA3_R_N: 1.P16(IO_L24N_T3_34) C84.2 R263.2
JA3_R_P: 1.P15(IO_L24P_T3_34) C84.1 R265.2
JA4_N: R264.1
JA4_P: R266.1
JA4_R_N: 1.R18(IO_L20N_T3_34) C85.2 R264.2
JA4_R_P: 1.T17(IO_L20P_T3_34) C85.1 R266.2
JB1_N: 1.V8(IO_L15P_T2_DQS_13)
JB1_P: 1.Y8(IO_L14N_T2_SRCC_13)
JB2_N: 1.U7(IO_L11P_T1_SRCC_13)
JB2_P: 1.V5(IO_L6N_T0_VREF_13)
JB3_N: 1.Y7(IO_L13P_T2_MRCC_13)
JB3_P: 1.U10(IO_L12N_T1_MRCC_13)
JB4_N: 1.V6(IO_L22P_T3_13)
JB4_P: 1.V10(IO_L21N_T3_DQS_13)
JC1_N: 1.J19(IO_L10N_T1_AD11N_35)
JC1_P: 1.K19(IO_L10P_T1_AD11P_35)
JC2_N: 1.B20(IO_L1N_T0_AD0N_35)
JC2_P: 1.C20(IO_L1P_T0_AD0P_35)
JC3_N: 1.M18(IO_L8N_T1_AD10N_35)
JC3_P: 1.M17(IO_L8P_T1_AD10P_35)
JC4_N: 1.A20(IO_L2N_T0_AD8N_35)
JC4_P: 1.B19(IO_L2P_T0_AD8P_35)
JD1_N: 1.E19(IO_L5N_T0_AD9N_35)
JD1_P: 1.E18(IO_L5P_T0_AD9P_35)
JD2_N: 1.F17(IO_L6N_T0_VREF_35)
JD2_P: 1.F16(IO_L6P_T0_35)
JD3_N: 1.L17(IO_L11N_T1_SRCC_35)
JD3_P: 1.L16(IO_L11P_T1_SRCC_35)
JD4_N: 1.N16(IO_L21N_T3_DQS_AD14N_35)
JD4_P: 1.N15(IO_L21P_T3_DQS_AD14P_35)
JE1: 1.D19(IO_L4P_T0_35)
JE2: 1.G20(IO_L18N_T2_AD13N_35)
JE3: 1.T19(IO_25_34)
JE4: 1.R16(IO_L19P_T3_34)
JE7: 1.D18(IO_L3N_T0_DQS_AD1N_35)
JE8: 1.L20(IO_L9N_T1_DQS_AD3N_35)
JE9: 1.K14(IO_L20P_T3_AD6P_35)
JE10: 1.M20(IO_L7N_T1_AD2N_35)
LED0: 1.M19(IO_L7P_T1_AD2P_35)
LED1: 1.P18(IO_L23N_T3_34)
LED2: 1.U19(IO_L12N_T1_MRCC_34)
LED3: 1.V13(IO_L3N_T0_DQS_34)
LED5_B: 1.U5(IO_L19N_T3_VREF_13)
LED5_G: 1.Y11(IO_L18N_T2_13)
LED5_R: 1.W11(IO_L18P_T2_13)
LED6_B: 1.W14(IO_L8P_T1_34)
LED6_G: 1.V15(IO_L10P_T1_34)
LED6_R: 1.R14(IO_L6N_T0_VREF_34)
LP_CLK_N: 1.W15(IO_L10N_T1_34)
LP_CLK_P: 1.Y19(IO_L17N_T2_34)
LP_LANE0_N: 1.Y14(IO_L8N_T1_34)
LP_LANE0_P: 1.T16(IO_L9P_T1_DQS_34)
LP_LANE1_N: 1.U17(IO_L9N_T1_DQS_34)
LP_LANE1_P: 1.Y18(IO_L17P_T2_34)
MIPI_CLK_N: 1.P20(IO_L14N_T2_SRCC_34)
MIPI_CLK_P: 1.N20(IO_L14P_T2_SRCC_34)
MIPI_LANE0_N: 1.Y17(IO_L7N_T1_34)
MIPI_LANE0_P: 1.Y16(IO_L7P_T1_34)
MIPI_LANE1_N: 1.U15(IO_L11N_T1_SRCC_34)
MIPI_LANE1_P: 1.U14(IO_L11P_T1_SRCC_34)
OTG_OC: 1.E17(IO_L3P_T0_DQS_AD1P_35)
SW0: 1.R17(IO_L19N_T3_VREF_34)
SW1: 1.K16(IO_L24P_T3_AD15P_35)
SW2: 1.D20(IO_L4N_T0_35)
SW3: 1.L19(IO_L9P_T1_DQS_AD3P_35)
SYSCLK: 1.U18(IO_L12P_T1_MRCC_34)

Not connected (* = marked no-connect by the designer): 1 T5(IO_L19P_T3_13) T9(IO_L12P_T1_MRCC_13) U8(IO_L17N_T2_13) U9(IO_L17P_T2_13) V7(IO_L11N_T1_SRCC_13) V11(IO_L21P_T3_DQS_13) W6(IO_L22N_T3_13) W8(IO_L15N_T2_DQS_13) W9(IO_L16N_T2_13) W10(IO_L16P_T2_13) Y6(IO_L13N_T2_MRCC_13) Y13(IO_L20N_T3_13)

### Layout directives
differential pair: JA1_R_N, JA1_R_P, JA2_R_N, JA2_R_P, JA3_R_N, JA3_R_P, JA4_R_N, JA4_R_P, MIPI_CLK_N, MIPI_CLK_P, MIPI_LANE0_N, MIPI_LANE0_P, MIPI_LANE1_N, MIPI_LANE1_P

### Notes on the sheet
- (near C82) No Load
- (near C83) No Load
- (near C84) No Load
- (near C85) No Load
- (in symbol XC7Z020-1CLG400C, part E) Bank 35
- (in symbol XC7Z020-1CLG400C, part F) Bank 34
- (in symbol XC7Z020-1CLG400C, part G) Bank 500

### Library data of the parts
1 = XC7Z020-1CLG400C: Integrated Circuit; Manufacturer_Name: AMD; Datasheet Link: http://www.xilinx.com/support/documentation/data_sheets/ds190-Zynq-7000-Overview.pdf; Height: 1.6mm; Manufacturer_Part_Number: XC7Z020-1CLG400C; Mouser Part Number: 217-XC7Z020-1CLG400C; Mouser Price/Stock: https://www.mouser.co.uk/ProductDetail/AMD-Xilinx/XC7Z020-1CLG400C?qs=rrS6PyfT74eaxuOsP%2FGL4g%3D%3D
C82-C85 = CMP-001-00084-2: MLCC 0402
R259-R266 = CMP-009-00178-3: Chip 0402 resistor

## Sheet FPGA_Power.SchDoc
size A4; SheetNumber: 11; SheetTotal: 13
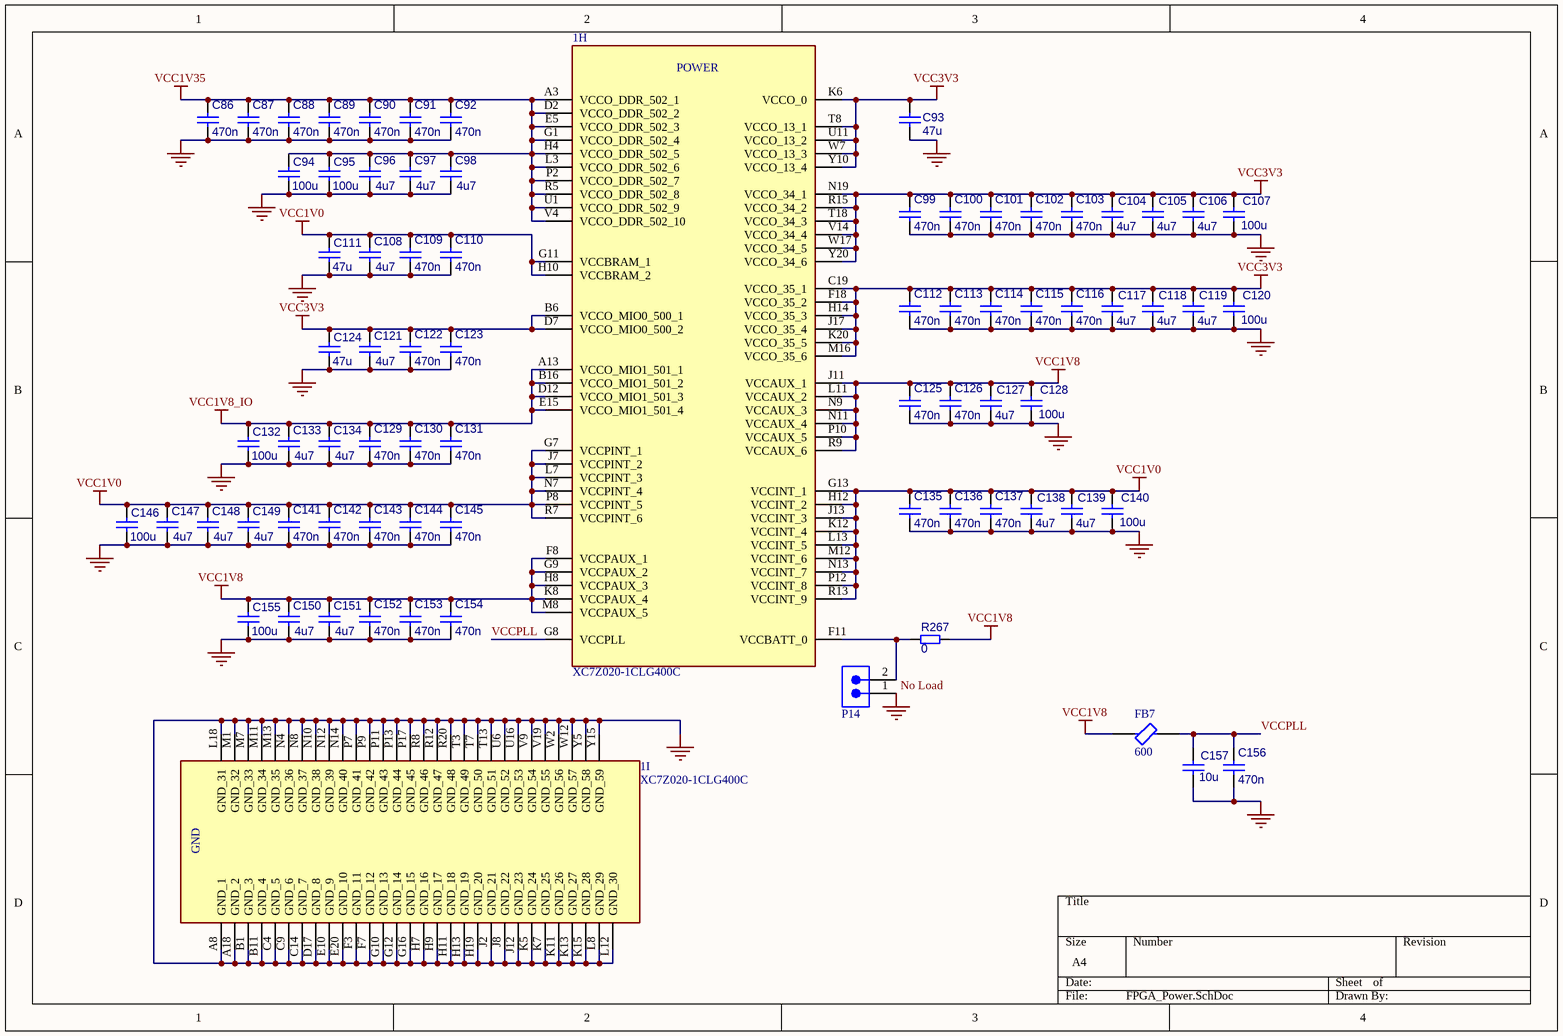
[diagram p10: FPGA_Power.SchDoc]

### Parts
1  XC7Z020-1CLG400C  [BGA400C80P20X20_1700X1700X160]  (parts H,I of 9)
C86  470n  [CAPC1005X50N_0402]
C87  470n  [CAPC1005X50N_0402]
C88  470n  [CAPC1005X50N_0402]
C89  470n  [CAPC1005X50N_0402]
C90  470n  [CAPC1005X50N_0402]
C91  470n  [CAPC1005X50N_0402]
C92  470n  [CAPC1005X50N_0402]
C93  47u  [C_1210]
C94  100u  [C_1210]
C95  100u  [C_1210]
C96  4u7  [C_0805]
C97  4u7  [C_0805]
C98  4u7  [C_0805]
C99  470n  [CAPC1005X50N_0402]
C100  470n  [CAPC1005X50N_0402]
C101  470n  [CAPC1005X50N_0402]
C102  470n  [CAPC1005X50N_0402]
C103  470n  [CAPC1005X50N_0402]
C104  4u7  [C_0805]
C105  4u7  [C_0805]
C106  4u7  [C_0805]
C107  100u  [C_1210]
C108  4u7  [C_0805]
C109  470n  [CAPC1005X50N_0402]
C110  470n  [CAPC1005X50N_0402]
C111  47u  [C_1210]
C112  470n  [CAPC1005X50N_0402]
C113  470n  [CAPC1005X50N_0402]
C114  470n  [CAPC1005X50N_0402]
C115  470n  [CAPC1005X50N_0402]
C116  470n  [CAPC1005X50N_0402]
C117  4u7  [C_0805]
C118  4u7  [C_0805]
C119  4u7  [C_0805]
C120  100u  [C_1210]
C121  4u7  [C_0805]
C122  470n  [CAPC1005X50N_0402]
C123  470n  [CAPC1005X50N_0402]
C124  47u  [C_1210]
C125  470n  [CAPC1005X50N_0402]
C126  470n  [CAPC1005X50N_0402]
C127  4u7  [C_0805]
C128  100u  [C_1210]
C129  470n  [CAPC1005X50N_0402]
C130  470n  [CAPC1005X50N_0402]
C131  470n  [CAPC1005X50N_0402]
C132  100u  [C_1210]
C133  4u7  [C_0805]
C134  4u7  [C_0805]
C135  470n  [CAPC1005X50N_0402]
C136  470n  [CAPC1005X50N_0402]
C137  470n  [CAPC1005X50N_0402]
C138  4u7  [C_0805]
C139  4u7  [C_0805]
C140  100u  [C_1210]
C141  470n  [CAPC1005X50N_0402]
C142  470n  [CAPC1005X50N_0402]
C143  470n  [CAPC1005X50N_0402]
C144  470n  [CAPC1005X50N_0402]
C145  470n  [CAPC1005X50N_0402]
C146  100u  [C_1210]
C147  4u7  [C_0805]
C148  4u7  [C_0805]
C149  4u7  [C_0805]
C150  4u7  [C_0805]
C151  4u7  [C_0805]
C152  470n  [CAPC1005X50N_0402]
C153  470n  [CAPC1005X50N_0402]
C154  470n  [CAPC1005X50N_0402]
C155  100u  [C_1210]
C156  470n  [CAPC1005X50N_0402]
C157  10u  [C_0805]
FB7  600  [FP-BLM31-0_2-t1_6-IPC_A]
P14  Male Pin Header 2x1 2.54mm  [Copy of Copy of Copy of Copy of 3M-2340-6111TG_V]  (value not drawn)
R267  0  [R_0402]

### Nets
GND: 1.A8(GND_1) 1.A18(GND_2) 1.B1(GND_3) 1.B11(GND_4) 1.C4(GND_5) 1.C9(GND_6) 1.C14(GND_7) 1.D17(GND_8) 1.E10(GND_9) 1.E20(GND_10) 1.F3(GND_11) 1.F7(GND_12) 1.G10(GND_13) 1.G12(GND_14) 1.G16(GND_15) 1.H7(GND_16) 1.H9(GND_17) 1.H11(GND_18) 1.H13(GND_19) 1.H19(GND_20) 1.J2(GND_21) 1.J8(GND_22) 1.J12(GND_23) 1.K5(GND_24) 1.K7(GND_25) 1.K11(GND_26) 1.K13(GND_27) 1.K15(GND_28) 1.L8(GND_29) 1.L12(GND_30) 1.L18(GND_31) 1.M1(GND_32) 1.M7(GND_33) 1.M11(GND_34) 1.M13(GND_35) 1.N4(GND_36) 1.N8(GND_37) 1.N10(GND_38) 1.N12(GND_39) 1.N14(GND_40) 1.P7(GND_41) 1.P9(GND_42) 1.P11(GND_43) 1.P13(GND_44) 1.P17(GND_45) 1.R8(GND_46) 1.R12(GND_47) 1.R20(GND_48) 1.T3(GND_49) 1.T7(GND_50) 1.T13(GND_51) 1.U6(GND_52) 1.U16(GND_53) 1.V9(GND_54) 1.V19(GND_55) 1.W2(GND_56) 1.W12(GND_57) 1.Y5(GND_58) 1.Y15(GND_59) C86.1 C87.1 C88.1 C89.1 C90.1 C91.1 C92.1 C93.2 C94.2 C95.2 C96.1 C97.1 C98.1 C99.1 C100.1 C101.1 C102.1 C103.1 C104.1 C105.1 C106.1 C107.2 C108.1 C109.1 C110.1 C111.2 C112.1 C113.1 C114.1 C115.1 C116.1 C117.1 C118.1 C119.1 C120.2 C121.1 C122.1 C123.1 C124.2 C125.1 C126.1 C127.1 C128.2 C129.1 C130.1 C131.1 C132.2 C133.1 C134.1 C135.1 C136.1 C137.1 C138.1 C139.1 C140.2 C141.1 C142.1 C143.1 C144.1 C145.1 C146.2 C147.1 C148.1 C149.1 C150.1 C151.1 C152.1 C153.1 C154.1 C155.2 C156.1 C157.1 P14.1
VCC1V0: 1.G7(VCCPINT_1) 1.G11(VCCBRAM_1) 1.G13(VCCINT_1) 1.H10(VCCBRAM_2) 1.H12(VCCINT_2) 1.J7(VCCPINT_2) 1.J13(VCCINT_3) 1.K12(VCCINT_4) 1.L7(VCCPINT_3) 1.L13(VCCINT_5) 1.M12(VCCINT_6) 1.N7(VCCPINT_4) 1.N13(VCCINT_7) 1.P8(VCCPINT_5) 1.P12(VCCINT_8) 1.R7(VCCPINT_6) 1.R13(VCCINT_9) C108.2 C109.2 C110.2 C111.1 C135.2 C136.2 C137.2 C138.2 C139.2 C140.1 C141.2 C142.2 C143.2 C144.2 C145.2 C146.1 C147.2 C148.2 C149.2
VCC1V8: 1.F8(VCCPAUX_1) 1.G9(VCCPAUX_2) 1.H8(VCCPAUX_3) 1.J11(VCCAUX_1) 1.K8(VCCPAUX_4) 1.L11(VCCAUX_2) 1.M8(VCCPAUX_5) 1.N9(VCCAUX_3) 1.N11(VCCAUX_4) 1.P10(VCCAUX_5) 1.R9(VCCAUX_6) C125.2 C126.2 C127.2 C128.1 C150.2 C151.2 C152.2 C153.2 C154.2 C155.1 FB7.1 R267.2
VCC1V8_IO: 1.A13(VCCO_MIO1_501_1) 1.B16(VCCO_MIO1_501_2) 1.D12(VCCO_MIO1_501_3) 1.E15(VCCO_MIO1_501_4) C129.2 C130.2 C131.2 C132.1 C133.2 C134.2
VCC1V35: 1.A3(VCCO_DDR_502_1) 1.D2(VCCO_DDR_502_2) 1.E5(VCCO_DDR_502_3) 1.G1(VCCO_DDR_502_4) 1.H4(VCCO_DDR_502_5) 1.L3(VCCO_DDR_502_6) 1.P2(VCCO_DDR_502_7) 1.R5(VCCO_DDR_502_8) 1.U1(VCCO_DDR_502_9) 1.V4(VCCO_DDR_502_10) C86.2 C87.2 C88.2 C89.2 C90.2 C91.2 C92.2 C94.1 C95.1 C96.2 C97.2 C98.2
VCC3V3: 1.B6(VCCO_MIO0_500_1) 1.C19(VCCO_35_1) 1.D7(VCCO_MIO0_500_2) 1.F18(VCCO_35_2) 1.H14(VCCO_35_3) 1.J17(VCCO_35_4) 1.K6(VCCO_0) 1.K20(VCCO_35_5) 1.M16(VCCO_35_6) 1.N19(VCCO_34_1) 1.R15(VCCO_34_2) 1.T8(VCCO_13_1) 1.T18(VCCO_34_3) 1.U11(VCCO_13_2) 1.V14(VCCO_34_4) 1.W7(VCCO_13_3) 1.W17(VCCO_34_5) 1.Y10(VCCO_13_4) 1.Y20(VCCO_34_6) C93.1 C99.2 C100.2 C101.2 C102.2 C103.2 C104.2 C105.2 C106.2 C107.1 C112.2 C113.2 C114.2 C115.2 C116.2 C117.2 C118.2 C119.2 C120.1 C121.2 C122.2 C123.2 C124.1
VCCPLL: 1.G8(VCCPLL) C156.2 C157.2 FB7.2
Net1_F11: 1.F11(VCCBATT_0) P14.2 R267.1

### Notes on the sheet
- No Load
- (in symbol XC7Z020-1CLG400C, part H) POWER
- (in symbol XC7Z020-1CLG400C, part I) GND

### Library data of the parts
1 = XC7Z020-1CLG400C: as 1 on sheet FPGA_Banks_and_Filters; Datasheet Link: http://www.xilinx.com/support/documentation/data_sheets/ds190-Zynq-7000-Overview.pdf; Height: 1.6mm; Manufacturer_Part_Number: XC7Z020-1CLG400C; Mouser Part Number: 217-XC7Z020-1CLG400C; Mouser Price/Stock: https://www.mouser.co.uk/ProductDetail/AMD-Xilinx/XC7Z020-1CLG400C?qs=rrS6PyfT74eaxuOsP%2FGL4g%3D%3D
C86-C92 C99-C103 C109 C110 C112-C116 C122 C123 C125 C126 C129-C131 C135-C137 C141-C145 C152-C154 C156 = CMP-001-00084-2: MLCC 0402
C93-C95 C107 C111 C120 C124 C128 C132 C140 C146 C155 = CMP-001-00088-1: 1210, X5R:EIA, 100uF, DC6.3V, GRM32ER60J107ME20
C96-C98 C104-C106 C108 C117-C119 C121 C127 C133 C134 C138 C139 C147-C151 C157 = CMP-001-00086-2: MLCC 0805
FB7 = CMP-06046-002432-1: Chip Ferrite Bead, 1206, 600Ω @ 100MHz, 0.038Ω, 25%, 2.9A; Number of Lines: 1; DC Resistance (DCR): 38mR; Max Operating Temperature: 125°C; Packaging: Cut Tape; Min Operating Temperature: -55°C; Mount: Surface Mount; Case Code (Metric): 3216; Case/Package: 1206; Case Code (Imperial): 1206; Max Current Rating: 2.9A
P14 = CMP-002-00078-1: Male Header, Pitch 2.54 mm, 2x 1 Position, Height 8.636 mm, Tail Length 3.05 mm, -55 to 105 degC, RoHS, Bulk; Manufacturer: 3M; Max Current Rating: 3A; Rows: 1; Gender: Male; Max Operating Temperature: 105°C; Contact Finish: Gold; Datasheet URL: https://datasheet.ciiva.com/5161/ts0766-242217-5161112.pdf; Pins: 40; Package Description: Male Header, Pitch 2.54 mm, 1 x 40 Position, Height 8.636 mm, Tail Length 3.05 mm; Contact Material: Copper; Package Reference: 2340-6111TG; Package Quantity: 200; Current Rating: 3A; Datasheet Version: Aug-08; Min Operating Temperature: -55°C; Connector Type: Header; Contact Plating: Gold; Case/Package: 2340-6111TG; Packaging: Bulk; RoHS Compliant: True; Manufacturer URL: http://www.3m.com/; Lead Pitch: 0.1inch; Colour: Black; Mounting Technology: TH
R267 = CMP-009-00178-3: Chip 0402 resistor

## Sheet DDR3_Memory.SchDoc
size A4; SheetNumber: 12; SheetTotal: 13
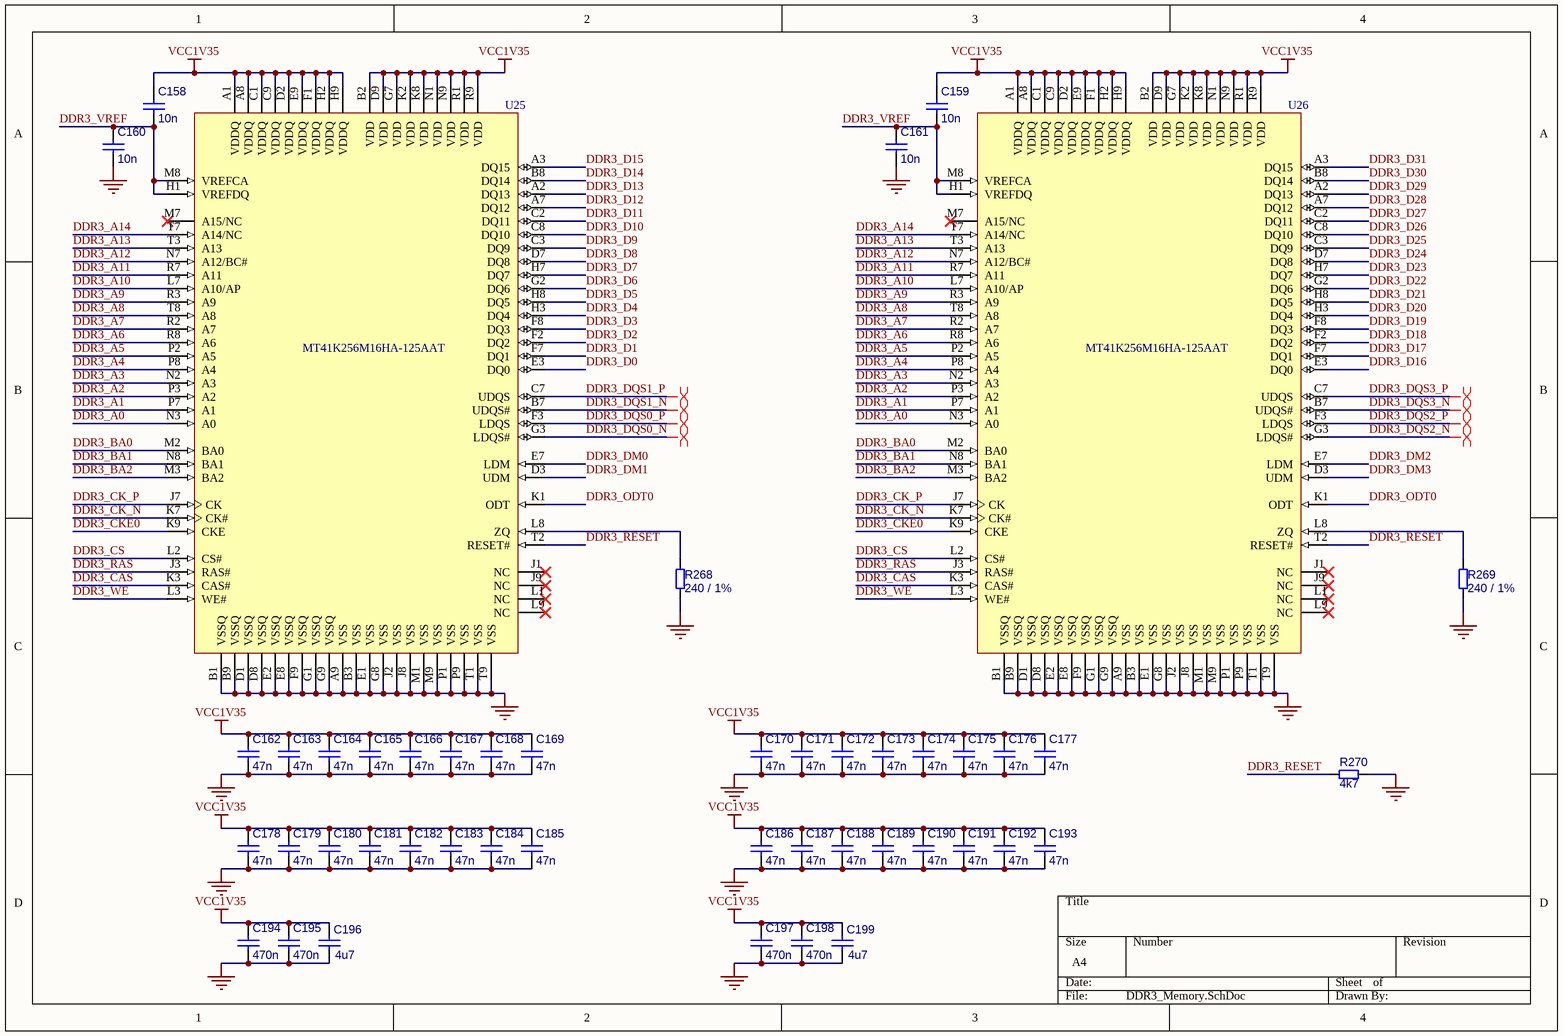
[diagram p11: DDR3_Memory.SchDoc]

### Parts
C158  10n  [CAPC1005X50N_0402]
C159  10n  [CAPC1005X50N_0402]
C160  10n  [CAPC1005X50N_0402]
C161  10n  [CAPC1005X50N_0402]
C162  47n  [CAPC1005X50N_0402]
C163  47n  [CAPC1005X50N_0402]
C164  47n  [CAPC1005X50N_0402]
C165  47n  [CAPC1005X50N_0402]
C166  47n  [CAPC1005X50N_0402]
C167  47n  [CAPC1005X50N_0402]
C168  47n  [CAPC1005X50N_0402]
C169  47n  [CAPC1005X50N_0402]
C170  47n  [CAPC1005X50N_0402]
C171  47n  [CAPC1005X50N_0402]
C172  47n  [CAPC1005X50N_0402]
C173  47n  [CAPC1005X50N_0402]
C174  47n  [CAPC1005X50N_0402]
C175  47n  [CAPC1005X50N_0402]
C176  47n  [CAPC1005X50N_0402]
C177  47n  [CAPC1005X50N_0402]
C178  47n  [CAPC1005X50N_0402]
C179  47n  [CAPC1005X50N_0402]
C180  47n  [CAPC1005X50N_0402]
C181  47n  [CAPC1005X50N_0402]
C182  47n  [CAPC1005X50N_0402]
C183  47n  [CAPC1005X50N_0402]
C184  47n  [CAPC1005X50N_0402]
C185  47n  [CAPC1005X50N_0402]
C186  47n  [CAPC1005X50N_0402]
C187  47n  [CAPC1005X50N_0402]
C188  47n  [CAPC1005X50N_0402]
C189  47n  [CAPC1005X50N_0402]
C190  47n  [CAPC1005X50N_0402]
C191  47n  [CAPC1005X50N_0402]
C192  47n  [CAPC1005X50N_0402]
C193  47n  [CAPC1005X50N_0402]
C194  470n  [CAPC1005X50N_0402]
C195  470n  [CAPC1005X50N_0402]
C196  4u7  [C_0805]
C197  470n  [CAPC1005X50N_0402]
C198  470n  [CAPC1005X50N_0402]
C199  4u7  [C_0805]
R268  240 / 1%  [R_0402]
R269  240 / 1%  [R_0402]
R270  4k7  [R_0402]
U25  MT41K256M16HA-125AAT  [MICT-HA-96]
U26  MT41K256M16HA-125AAT  [MICT-HA-96]

### Nets
DDR3_VREF: C158.1 C159.1 C160.2 C161.2 U25.H1(VREFDQ) U25.M8(VREFCA) U26.H1(VREFDQ) U26.M8(VREFCA)
GND: C160.1 C161.1 C162.1 C163.1 C164.1 C165.1 C166.1 C167.1 C168.1 C169.1 C170.1 C171.1 C172.1 C173.1 C174.1 C175.1 C176.1 C177.1 C178.1 C179.1 C180.1 C181.1 C182.1 C183.1 C184.1 C185.1 C186.1 C187.1 C188.1 C189.1 C190.1 C191.1 C192.1 C193.1 C194.1 C195.1 C196.1 C197.1 C198.1 C199.1 R268.1 R269.1 R270.1 U25.A9(VSS) U25.B1(VSSQ) U25.B3(VSS) U25.B9(VSSQ) U25.D1(VSSQ) U25.D8(VSSQ) U25.E1(VSS) U25.E2(VSSQ) U25.E8(VSSQ) U25.F9(VSSQ) U25.G1(VSSQ) U25.G8(VSS) U25.G9(VSSQ) U25.J2(VSS) U25.J8(VSS) U25.M1(VSS) U25.M9(VSS) U25.P1(VSS) U25.P9(VSS) U25.T1(VSS) U25.T9(VSS) U26.A9(VSS) U26.B1(VSSQ) U26.B3(VSS) U26.B9(VSSQ) U26.D1(VSSQ) U26.D8(VSSQ) U26.E1(VSS) U26.E2(VSSQ) U26.E8(VSSQ) U26.F9(VSSQ) U26.G1(VSSQ) U26.G8(VSS) U26.G9(VSSQ) U26.J2(VSS) U26.J8(VSS) U26.M1(VSS) U26.M9(VSS) U26.P1(VSS) U26.P9(VSS) U26.T1(VSS) U26.T9(VSS)
VCC1V35: C158.2 C159.2 C162.2 C163.2 C164.2 C165.2 C166.2 C167.2 C168.2 C169.2 C170.2 C171.2 C172.2 C173.2 C174.2 C175.2 C176.2 C177.2 C178.2 C179.2 C180.2 C181.2 C182.2 C183.2 C184.2 C185.2 C186.2 C187.2 C188.2 C189.2 C190.2 C191.2 C192.2 C193.2 C194.2 C195.2 C196.2 C197.2 C198.2 C199.2 U25.A1(VDDQ) U25.A8(VDDQ) U25.B2(VDD) U25.C1(VDDQ) U25.C9(VDDQ) U25.D2(VDDQ) U25.D9(VDD) U25.E9(VDDQ) U25.F1(VDDQ) U25.G7(VDD) U25.H2(VDDQ) U25.H9(VDDQ) U25.K2(VDD) U25.K8(VDD) U25.N1(VDD) U25.N9(VDD) U25.R1(VDD) U25.R9(VDD) U26.A1(VDDQ) U26.A8(VDDQ) U26.B2(VDD) U26.C1(VDDQ) U26.C9(VDDQ) U26.D2(VDDQ) U26.D9(VDD) U26.E9(VDDQ) U26.F1(VDDQ) U26.G7(VDD) U26.H2(VDDQ) U26.H9(VDDQ) U26.K2(VDD) U26.K8(VDD) U26.N1(VDD) U26.N9(VDD) U26.R1(VDD) U26.R9(VDD)
DDR3_A0: U25.N3(A0) U26.N3(A0)
DDR3_A1: U25.P7(A1) U26.P7(A1)
DDR3_A2: U25.P3(A2) U26.P3(A2)
DDR3_A3: U25.N2(A3) U26.N2(A3)
DDR3_A4: U25.P8(A4) U26.P8(A4)
DDR3_A5: U25.P2(A5) U26.P2(A5)
DDR3_A6: U25.R8(A6) U26.R8(A6)
DDR3_A7: U25.R2(A7) U26.R2(A7)
DDR3_A8: U25.T8(A8) U26.T8(A8)
DDR3_A9: U25.R3(A9) U26.R3(A9)
DDR3_A10: U25.L7(A10/AP) U26.L7(A10/AP)
DDR3_A11: U25.R7(A11) U26.R7(A11)
DDR3_A12: U25.N7(A12/BC#) U26.N7(A12/BC#)
DDR3_A13: U25.T3(A13) U26.T3(A13)
DDR3_A14: U25.T7(A14/NC) U26.T7(A14/NC)
DDR3_BA0: U25.M2(BA0) U26.M2(BA0)
DDR3_BA1: U25.N8(BA1) U26.N8(BA1)
DDR3_BA2: U25.M3(BA2) U26.M3(BA2)
DDR3_CAS: U25.K3(CAS#) U26.K3(CAS#)
DDR3_CK_N: U25.K7(CK#) U26.K7(CK#)
DDR3_CK_P: U25.J7(CK) U26.J7(CK)
DDR3_CKE0: U25.K9(CKE) U26.K9(CKE)
DDR3_CS: U25.L2(CS#) U26.L2(CS#)
DDR3_D0: U25.E3(DQ0)
DDR3_D1: U25.F7(DQ1)
DDR3_D2: U25.F2(DQ2)
DDR3_D3: U25.F8(DQ3)
DDR3_D4: U25.H3(DQ4)
DDR3_D5: U25.H8(DQ5)
DDR3_D6: U25.G2(DQ6)
DDR3_D7: U25.H7(DQ7)
DDR3_D8: U25.D7(DQ8)
DDR3_D9: U25.C3(DQ9)
DDR3_D10: U25.C8(DQ10)
DDR3_D11: U25.C2(DQ11)
DDR3_D12: U25.A7(DQ12)
DDR3_D13: U25.A2(DQ13)
DDR3_D14: U25.B8(DQ14)
DDR3_D15: U25.A3(DQ15)
DDR3_D16: U26.E3(DQ0)
DDR3_D17: U26.F7(DQ1)
DDR3_D18: U26.F2(DQ2)
DDR3_D19: U26.F8(DQ3)
DDR3_D20: U26.H3(DQ4)
DDR3_D21: U26.H8(DQ5)
DDR3_D22: U26.G2(DQ6)
DDR3_D23: U26.H7(DQ7)
DDR3_D24: U26.D7(DQ8)
DDR3_D25: U26.C3(DQ9)
DDR3_D26: U26.C8(DQ10)
DDR3_D27: U26.C2(DQ11)
DDR3_D28: U26.A7(DQ12)
DDR3_D29: U26.A2(DQ13)
DDR3_D30: U26.B8(DQ14)
DDR3_D31: U26.A3(DQ15)
DDR3_DM0: U25.E7(LDM)
DDR3_DM1: U25.D3(UDM)
DDR3_DM2: U26.E7(LDM)
DDR3_DM3: U26.D3(UDM)
DDR3_DQS0_N: U25.G3(LDQS#)
DDR3_DQS0_P: U25.F3(LDQS)
DDR3_DQS1_N: U25.B7(UDQS#)
DDR3_DQS1_P: U25.C7(UDQS)
DDR3_DQS2_N: U26.G3(LDQS#)
DDR3_DQS2_P: U26.F3(LDQS)
DDR3_DQS3_N: U26.B7(UDQS#)
DDR3_DQS3_P: U26.C7(UDQS)
DDR3_ODT0: U25.K1(ODT) U26.K1(ODT)
DDR3_RAS: U25.J3(RAS#) U26.J3(RAS#)
DDR3_RESET: R270.2 U25.T2(RESET#) U26.T2(RESET#)
DDR3_WE: U25.L3(WE#) U26.L3(WE#)
NetR268_2: R268.2 U25.L8(ZQ)
NetR269_2: R269.2 U26.L8(ZQ)

Not connected (* = marked no-connect by the designer): U25 J1(NC)* J9(NC)* L1(NC)* L9(NC)* M7(A15/NC)*; U26 J1(NC)* J9(NC)* L1(NC)* L9(NC)* M7(A15/NC)*

### Layout directives
differential pair: DDR3_DQS0_N, DDR3_DQS0_P, DDR3_DQS1_N, DDR3_DQS1_P, DDR3_DQS2_N, DDR3_DQS2_P, DDR3_DQS3_N, DDR3_DQS3_P

### Library data of the parts
C158-C195 C197 C198 = CMP-001-00084-2: MLCC 0402
C196 C199 = CMP-001-00086-2: MLCC 0805
R268-R270 = CMP-009-00178-3: Chip 0402 resistor
U25 U26 = CMP-019-00061-1: DDR3L Dram, 256MX16, Cmos, PBGA96; Max Supply Voltage: 1.45V; Min Supply Voltage: 1.283V; Case/Package: TFBGA